# Altium project Flight Controller Base.PrjPcb (part 2 of 2)

## Sheet S6_Debug_Safety_Port.SchDoc
size 420 x 297 mm; SheetNumber: 6; SheetTotal: 8
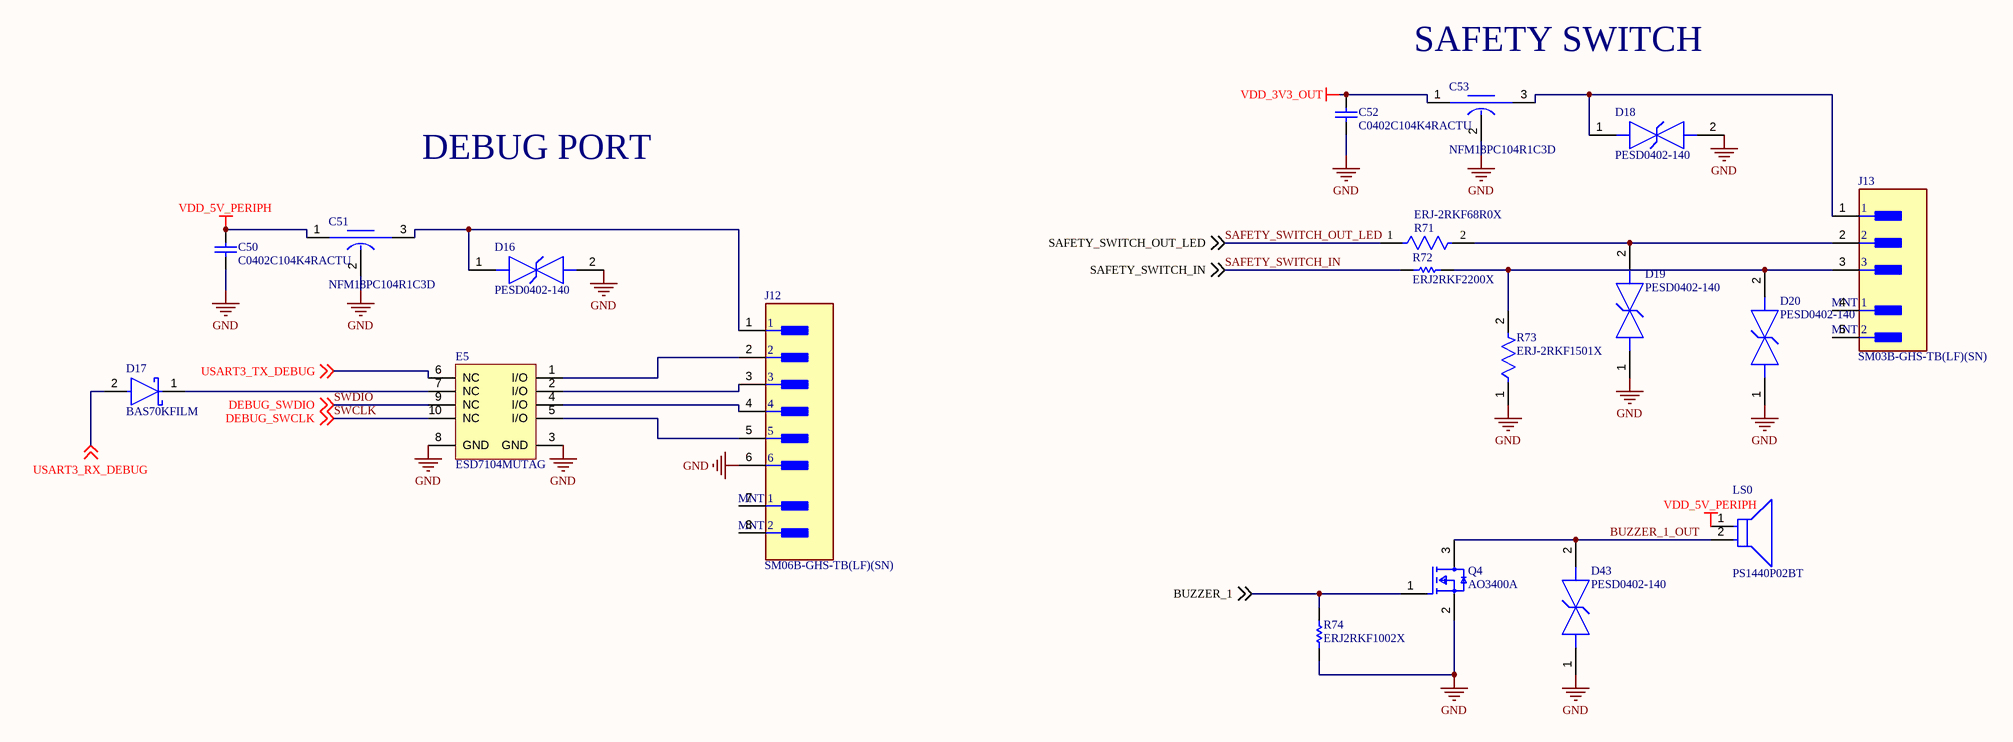
[diagram p5: S6_Debug_Safety_Port.SchDoc]

### Parts
C50  C0402C104K4RACTU  [CAPC1005X55X30LL05T10]
C51  NFM18PC104R1C3D  [FP-NFM18-0_1-e0_15_0_35-MFG]
C52  C0402C104K4RACTU  [CAPC1005X55X30LL05T10]
C53  NFM18PC104R1C3D  [FP-NFM18-0_1-e0_15_0_35-MFG]
D16  PESD0402-140  [FP-PESD0402-MFG]
D17  BAS70KFILM  [FP-SOD-523-IPC_B]
D18  PESD0402-140  [FP-PESD0402-MFG]
D19  PESD0402-140  [FP-PESD0402-MFG]
D20  PESD0402-140  [FP-PESD0402-MFG]
D43  PESD0402-140  [FP-PESD0402-MFG]
E5  ESD7104MUTAG  [ONSC-UDFN-10-517BB-01_V]
J12  SM06B-GHS-TB(LF)(SN)  [FP-SM06B-GHS-TB_LF_SN-MFG]
J13  SM03B-GHS-TB(LF)(SN)  [FP-SM03B-GHS-TB_LF_SN-MFG]
LS0  PS1440P02BT  [FP-PS1440P02BT-MFG]
Q4  AO3400A  [FP-SOT23-MFG]
R71  ERJ-2RKF68R0X  [FP-ERJ2RK-MFG]
R72  ERJ2RKF2200X  [RESC1005X40X25LL05T05]
R73  ERJ-2RKF1501X  [FP-ERJ2RK-IPC_A]
R74  ERJ2RKF1002X  [RESC1005X40X25LL05T05]

### Nets
GND: C50.1 C51.2(GND) C52.1 C53.2(GND) D16.2 D18.2 D19.1 D20.1 D43.1 E5.3(GND) E5.8(GND) J12.6 Q4.2(S) R73.1 R74.1
VDD_3V3_OUT: C52.2 C53.1(Input)
VDD_5V_PERIPH: C50.2 C51.1(Input) LS0.1
BUZZER_1: Q4.1(G) R74.2 ; off-sheet BUZZER_1
BUZZER_1_OUT: D43.2 LS0.2 Q4.3(D)
SAFETY_SWITCH_IN: R72.1 ; off-sheet SAFETY_SWITCH_IN
SAFETY_SWITCH_OUT_LED: R71.1 ; off-sheet SAFETY_SWITCH_OUT_LED
SWCLK: E5.10(NC) ; off-sheet DEBUG_SWCLK  [also labelled DEBUG_SWCLK]
SWDIO: E5.9(NC) ; off-sheet DEBUG_SWDIO  [also labelled DEBUG_SWDIO]
USART3_RX_DEBUG: D17.2(A) ; off-sheet USART3_RX_DEBUG
USART3_TX_DEBUG: E5.6(NC) ; off-sheet USART3_TX_DEBUG
NetC51_3: C51.3(Output) D16.1 J12.1
NetC53_3: C53.3(Output) D18.1 J13.1
NetD17_1: D17.1(C) E5.7(NC)
NetD19_2: D19.2 J13.2 R71.2
NetD20_2: D20.2 J13.3 R72.2 R73.2
NetE5_1: E5.1(I/O) J12.2
NetE5_2: E5.2(I/O) J12.3
NetE5_4: E5.4(I/O) J12.4
NetE5_5: E5.5(I/O) J12.5

Not connected (* = marked no-connect by the designer): J12 7(MNT_1) 8(MNT_2); J13 4(MNT_1) 5(MNT_2)

### Notes on the sheet
- (near C53) SAFETY SWITCH
- DEBUG PORT
- THIS DOCUMENT AND THE DATA DISCLOSED HEREIN OR
- HEREWITH IS THE PROPERTY OF ALTIUM LIMITED AND MAY
- DWG NO:
- REVISION
- REV:
- DESCRIPTION
- DATE
- APPROVED
- BE FREELY DISTRIBUTED IN WHOLE. NO RIGHTS ARE
- RESERVED OR EXPRESS OR IMPLIED WARANTEE GIVEN.
- ENG:
- APPROVALS
- PROJECT
- DSN:
- CHK:
- REFERENCE DOCUMENTS
- PROJECT REVISION:
- TITLE
- DOCUMENT REVISION:
- DESIGN ITEM:
- BOM:
- FAB DWG:
- PCB DWG:
- ASSY DWG:
- SCALE:
- A3
- SIZE
- CAGE CODE
- FILE NAME
- DWG NO.
- SHEET
- OF
- REV

### Library data of the parts
C50 C52 = CMP-0001-00074-2: Manufacturer: Kemet; Part Number: C0402C104K4RACTU
C51 C53 = CMP-06053-000054-1: Large Current 3 Terminals Low ESL Chip Multilayer Ceramic Capacitors for General Purpose, 0603, 0.10uF, 20%, 16V; Capacitance: 100nF; Insulation Resistance: 1GR; Current Rating: 2A; DC Resistance (DCR): 30mR; Case Code (Imperial): 0603; REACH SVHC: No SVHC; Width: 0.8mm; Case Code (Metric): 1608; Voltage Rating (DC): 16V; Case/Package: 0603; Packaging: Tape and Reel; Length: 1.6mm; Height: 0.6mm; Voltage: 16V; Depth: 0.8mm; Radiation Hardening: No; Max Operating Temperature: 125°C; Max Voltage Rating (DC): 16V; Voltage Rating: 16V; Max Current Rating: 2A; Tolerance: 20%; Min Operating Temperature: -55°C; Mount: PCB; Termination: Flat; Current: 2A; Package Quantity: 4000; Lead Free: Lead Free
D16 D18-D20 D43 = CMP-08607-000011-1: TVS DIODE 14V 40V 0402; Manufacturer: Littelfuse Inc.; Automotive Grade: Grade 1; Capacitance: 0.25pF; Value: 0.25pF; Direction: Bidirectional; Number Of Channels: 1; Temperature Range Low: -55°C; Lead Free: Yes; Temperature: -55°C to +125°C; Digikey Description: TVS DIODE 14V 40V 0402; Automotive: Yes; Device Class L2: TVS Diodes; Reverse Standoff Voltage: 14V; Device Class L1: Circuit Protection; Ipc Land Pattern Name: DIOC10050X33; Manufacturer Part Number: PESD0402-140; Breakdown Voltage: 14V; Height: 0.43mm; Clamping Voltage: 40V; RoHS: TRUE; Temperature Range High: +125°C; Device Class L3: unset; Octopart: https://octopart.com/pesd0402-140-littelfuse-74215061; Package: PESD0402; ComponentLink2URL: https://www.littelfuse.com/~/media/electronics/datasheets/polymer_esd_suppressors/littelfuse_polymer_esd_suppressor_pesd_catalog_datasheet.pdf.pdf; Category: Diode; ComponentLink2Description: Datasheet
D17 = CMP-12187-000033-1: DIODE SCHOTTKY 70V 70MA SOD523; Peak Non-Repetitive Surge Current: 1A; Forward Voltage: 1V; Element Configuration: Single; Polarity: Standard; Max Reverse Leakage Current: 10uA; Packaging: Tape and Reel; RoHS Compliant: Yes; Width: 0.9mm; Contact Plating: Tin; Series: -; Lead Free: Lead Free; REACH SVHC: No SVHC; Voltage Rating (DC): 70V; Current Rating: 70mA; Max Reverse Voltage (DC): 70V; Average Rectified Current: 70mA; Output Current: 70mA; Min Operating Temperature: -65°C; Length: 1.3mm; Max Operating Temperature: 150°C; Max Surge Current: 1A; Height: 0.7mm; Radiation Hardening: No; Mount: Surface Mount; Max Repetitive Reverse Voltage (Vrrm): 70V; Package Quantity: 1; Reverse Voltage (DC): 70V; Number of Pins: 2; Max Reverse Current: 10uA; Forward Current: 70mA
E5 = CMP-1063-00242-1: Transient Voltage Suppressor, Low Capacitance ESD Protection for High Speed Data, 10-Pin UDFN, Pb-Free, Tape and Reel; Manufacturer: On Semiconductor; IR Max (uA): 1; Number of Lines: 4; VRWM Max (V): 5; Direction: Bidirectional; V(BR) Min (V): 5.5; PackageDescription: 10-Pin Small Outline No-Lead, Body 2.5 x 1 mm, Pitch 0.5 mm; ComponentLink3URL: http://www.onsemi.com/pub_link/Collateral/517BB.PDF; PackageReference: UDFN-10-517BB-01; Mounting Technology: Surface Mount; PartNumber: ESD7104MUTAG; ComponentLink1URL: http://www.onsemi.com/; ComponentLink1Description: Manufacturer URL; DatasheetVersion: Rev. 2; ComponentLink2Description: Datasheet; ComponentLink2URL: http://www.onsemi.cn/pub_link/Collateral/ESD7104-D.PDF; PackageVersion: Rev. O, 11/2009; Packing: Tape and Reel; RoHS: Pb-Free; ComponentLink3Description: Package Specification
J12 = CMP-17439-000061-1: CONN HEADER SMD R/A 6POS 1.25MM; Number of Contacts: 6; Voltage Rating: 50V; Current Rating: 1A; Connector Type: Outer Shroud Contact; Contact Resistance: 50mR; Orientation: Right Angle; Max Operating Temperature: 85°C; Mount: Surface Mount; Packaging: Tape and Reel; Contact Plating: Tin; Depth: 4.05mm; Max Voltage Rating (AC): 50V; Lead Free: Lead Free; Pitch: 1.25mm; Number of Positions: 6; Max Current Rating: 1A; Termination: Solder; Min Operating Temperature: -25°C; Housing Color: Beige; Fastening Type: Ramp; Length: 10.75mm; Color: Natural; Contact Material: Bronze; Housing Material: Polyamide; Number of Rows: 1
J13 = CMP-17439-000068-1: CONN HEADER SMD R/A 3POS 1.25MM; Voltage Rating: 50V; Wire/Cable Gauge: 26AWG; Pitch: 0.049inch; Gender: Male; Number of Positions: 3; Current Rating: 1A; Orientation: Right Angle; REACH SVHC: No SVHC; Insulation Color: Natural; Housing Material: Nylon; Mount: Surface Mount; Flammability Rating: UL94 V-0; Color: Natural; Number of Rows: 1; Housing Color: Natural; Termination: Solder; Voltage Rating (AC): 50V; Max Operating Temperature: 85°C; Connector Type: Header; Series: GH; Packaging: Tape and Reel; Contact Finish - Mating: TIN; Lead Free: Lead Free; Fastening Type: Ramp; Contact Plating: Tin; Contact Material: Bronze; Insulation Material: Nylon; Contact Type: Outer Shroud Contact; Number of Contacts: 3; Min Operating Temperature: -25°C; Contact Shape: Rectangular
LS0 = CMP-08413-000003-1: AUDIO PIEZO TRANSDUCER 30V TH; Self Resonant Frequency: 4kHz; Washable: No; Voltage Rating (DC): 3V; Number of Terminals/Pins: 2; Packaging: Tape and Reel; Lead Free: Lead Free; Min Operating Temperature: -10°C; Package Quantity: 350; Termination: PC Pins; Mount: Through Hole; Max Operating Temperature: 70°C; Operating Supply Voltage: 3V; Diameter: 14mm; RoHS Compliant: Yes; Frequency: 4kHz; Height: 8mm
Q4 = CMP-83955-000006-1: MOSFET N-CH 30V 5.7A SOT23; Input Capacitance: 630pF; Number of Elements: 1; Rds On Max: 26.5mR; Max Power Dissipation: 1.4W; Gate to Source Voltage (Vgs): 12V; Min Operating Temperature: -55°C; Lead Free: Lead Free; Number of Pins: 3; Drain to Source Voltage (Vdss): 30V; Case/Package: SOT-23; Mount: Surface Mount; Continuous Drain Current (ID): 5.7A; Radiation Hardening: No; Packaging: Tape and Reel; Max Operating Temperature: 150°C; Power Dissipation: 1.4W
R71 = CMP-2002-01170-2: NexarPartId: 55529255; Voltage Rating: 50V; Temperature Coefficient: 100ppm/°C; Power Rating: 100mW; Resistance: 68Ω; Tolerance: 1%; Case Code (Imperial): 0402; Length: 1mm; REACH SVHC: No SVHC; Lead Free: Lead Free; Packaging: Cut Tape; RoHS: Compliant; Features: Automotive AEC-Q200; Voltage Rating (DC): 50V; Height: 350µm; Number of Pins: 2; Schedule B: 8533210045, 8533210045; Composition: Thick Film; Case/Package: 0402; Width: 508µm; Number of Terminations: 2; Min Operating Temperature: -55°C; Mount: Surface Mount; Depth: 500µm; Weight: 793.786648µg; Military Standard: Not; Termination: SMD/SMT; Max Power Dissipation: 100mW; Max Operating Temperature: 155°C; Lifecycle Status: Production; Contact Plating: Tin; Case Code (Metric): 1005
R72 = CMP-2002-01131-1: Manufacturer: Panasonic; Part Number: ERJ2RKF2200X
R73 = CMP-2002-00693-2: RES SMD 1.5K OHM 1% 1/10W 0402; Voltage Rating (DC): 50V; Temperature Coefficient: 100ppm/°C; Power Rating: 100mW; Resistance: 1.5kR; Features: Automotive AEC-Q200; Termination: SMD/SMT; Size Code: 0402; Mount: Surface Mount; Min Operating Temperature: -55°C; Construction: Rectangular; Case Code (Metric): 1005; Depth: 0.5mm; Max Operating Temperature: 155°C; RoHS Compliant: Yes; Packaging: Tape and Reel; Number of Pins: 2; Military Standard: Not; Package Quantity: 1; Height: 0.35mm; Resistor Type: Thick Film; Radiation Hardening: No; Length: 1mm; Case Code (Imperial): 0402; Tolerance: 1%; Voltage Rating: 50V; Resistance Tolerance: 1%; Contact Plating: Tin; Case/Package: 0402; REACH SVHC: No SVHC; Max Power Dissipation: 100mW; Series: ERJ; Technology: THICK FILM; Number of Terminations: 2; Width: 0.02inch; Lead Free: Lead Free
R74 = CMP-2000-07588-1: Chip Resistor, 10 KOhm, +/- 1%, 0.1 W, -55 to 155 degC, 0402 (1005 Metric), RoHS, Tape and Reel; Manufacturer: Panasonic; Power Rating: 100mW; Voltage Rating: 50V; Resistance: 10KOhm; Case\/Package: 0402; Temperature Coefficient: 100ppm\/degreesC; RoHSCompliant: True; Lead Free: LeadFree; Package Quantity: 1; Contact Plating: Tin; Length: 1mm; Radiation Hardening: No; REACH SVHC: NoSVHC; Max Operating Temperature: 155degC; Depth: 0.5mm; Case Code (Imperial): 0402; Military Standard: Not; Package Description: 2-Pin Surface Mount Device, Body 1 x 0.5 mm; Termination: SMD/SMT; Case Code (Metric): 1005; Height: 0.35mm; Packaging: TapeandReel; Voltage Rating (DC): 50V; Package Reference: 402; Number of Pins: 2; Tolerance: 1%; Mounting Technology: SurfaceMount; Width: 0.02inch; Mount: SurfaceMount; Datasheet URL: https://industrial.panasonic.com/cdbs/www-data/pdf/RDA0000/AOA0000C304.pdf; Composition: ThickFilm; Datasheet Version: 02/2017; Manufacturer URL: http://www.panasonic.com/; Max Power Dissipation: 100mW; Number of Terminations: 2; Min Operating Temperature: -55degC

## Sheet S7_Ethernet.SchDoc
size A3; SheetNumber: 4; SheetTotal: 7
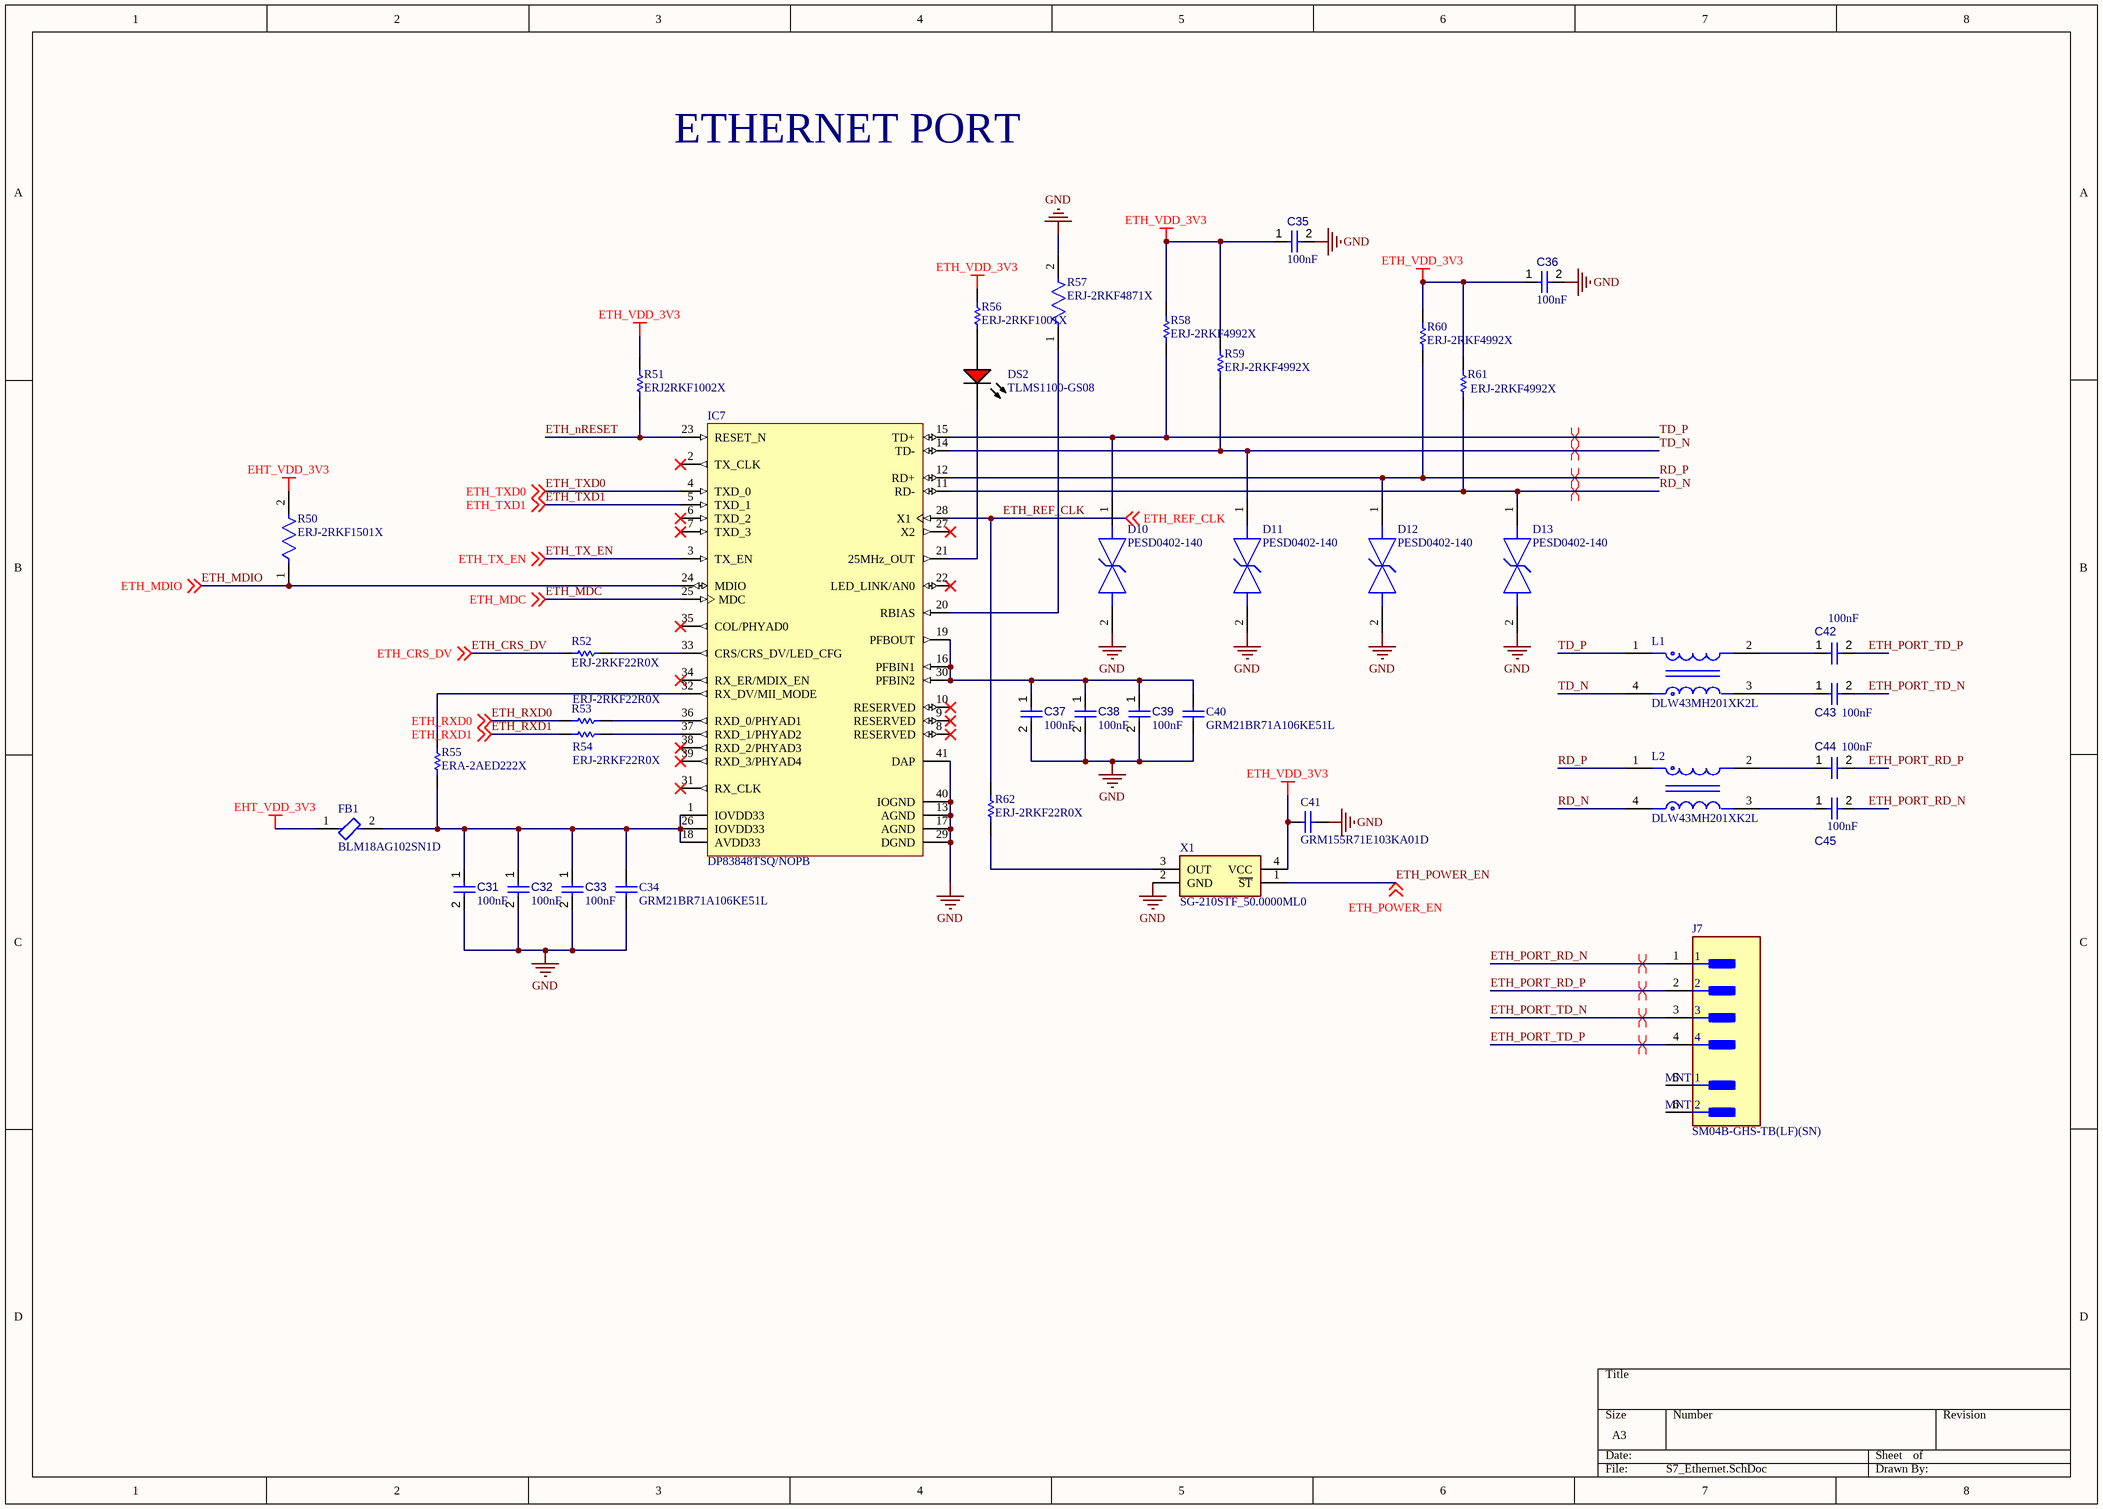
[diagram p6: S7_Ethernet.SchDoc]

### Parts
C31  value 100nF  [CAPC0402(1005)60_L]  (hidden comment: Capacitor 100nF +/-20% 25V 0402)
C32  value 100nF  [CAPC0402(1005)60_L]  (hidden comment: Capacitor 100nF +/-20% 25V 0402)
C33  value 100nF  [CAPC0402(1005)60_L]  (hidden comment: Capacitor 100nF +/-20% 25V 0402)
C34  GRM21BR71A106KE51L  [CAPC2013X140X45NL15T25]
C35  value 100nF  [CAPC0402(1005)60_L]  (hidden comment: Capacitor 100nF +/-20% 25V 0402)
C36  value 100nF  [CAPC0402(1005)60_L]  (hidden comment: Capacitor 100nF +/-20% 25V 0402)
C37  value 100nF  [CAPC0402(1005)60_L]  (hidden comment: Capacitor 100nF +/-20% 25V 0402)
C38  value 100nF  [CAPC0402(1005)60_L]  (hidden comment: Capacitor 100nF +/-20% 25V 0402)
C39  value 100nF  [CAPC0402(1005)60_L]  (hidden comment: Capacitor 100nF +/-20% 25V 0402)
C40  GRM21BR71A106KE51L  [CAPC2013X140X45NL15T25]
C41  GRM155R71E103KA01D  [CAPC1005X55X25LL05T10]
C42  value 100nF  [CAPC0402(1005)60_L]  (hidden comment: Capacitor 100nF +/-20% 25V 0402)
C43  value 100nF  [CAPC0402(1005)60_L]  (hidden comment: Capacitor 100nF +/-20% 25V 0402)
C44  value 100nF  [CAPC0402(1005)60_L]  (hidden comment: Capacitor 100nF +/-20% 25V 0402)
C45  value 100nF  [CAPC0402(1005)60_L]  (hidden comment: Capacitor 100nF +/-20% 25V 0402)
D10  PESD0402-140  [FP-PESD0402-MFG]
D11  PESD0402-140  [FP-PESD0402-MFG]
D12  PESD0402-140  [FP-PESD0402-MFG]
D13  PESD0402-140  [FP-PESD0402-MFG]
DS2  TLMS1100-GS08  [VISH-TLMX1100_V]
FB1  BLM18AG102SN1D  [FP-BLM18-0_15-t0_8-MFG]
IC7  DP83848TSQ/NOPB  [RTA0040A_V]
J7  SM04B-GHS-TB(LF)(SN)  [FP-SM04B-GHS-TB_LF_SN-MFG]
L1  DLW43MH201XK2L  [FP-DLW43-0_2-t2_7-MFG]
L2  DLW43MH201XK2L  [FP-DLW43-0_2-t2_7-MFG]
R50  ERJ-2RKF1501X  [FP-ERJ2RK-IPC_A]
R51  ERJ2RKF1002X  [RESC1005X40X25LL05T05]
R52  ERJ-2RKF22R0X  [RESC1005X40X25ML05T05]
R53  ERJ-2RKF22R0X  [RESC1005X40X25ML05T05]
R54  ERJ-2RKF22R0X  [RESC1005X40X25ML05T05]
R55  ERA-2AED222X  [RESC1005X40X25ML10T10]
R56  ERJ-2RKF1001X  [RESC1005X40X25NL05T05]
R57  ERJ-2RKF4871X  [FP-ERJ2RK-MFG]
R58  ERJ-2RKF4992X  [RESC1005X40X25LL05T05]
R59  ERJ-2RKF4992X  [RESC1005X40X25LL05T05]
R60  ERJ-2RKF4992X  [RESC1005X40X25LL05T05]
R61  ERJ-2RKF4992X  [RESC1005X40X25LL05T05]
R62  ERJ-2RKF22R0X  [RESC1005X40X25ML05T05]
X1  SG-210STF_50.0000ML0  [SG210STF500000ML0]

### Nets
EHT_VDD_3V3: FB1.1 R50.2
ETH_VDD_3V3: C35.1 C36.1 C41.1 R51.2 R56.2 R58.2 R59.2 R60.2 R61.2 X1.4(VCC)
GND: C31.2 C32.2 C33.2 C34.1 C35.2 C36.2 C37.2 C38.2 C39.2 C40.1 C41.2 D10.2 D11.2 D12.2 D13.2 IC7.13(AGND) IC7.17(AGND) IC7.29(DGND) IC7.40(IOGND) IC7.41(DAP) R57.2 X1.2(GND)
ETH_CRS_DV: R52.1 ; off-sheet ETH_CRS_DV
ETH_MDC: IC7.25(MDC) ; off-sheet ETH_MDC
ETH_MDIO: IC7.24(MDIO) R50.1 ; off-sheet ETH_MDIO
ETH_nRESET: IC7.23(RESET_N) R51.1
ETH_PORT_RD_N: C45.2 J7.1
ETH_PORT_RD_P: C44.2 J7.2
ETH_PORT_TD_N: C43.2 J7.3
ETH_PORT_TD_P: C42.2 J7.4
ETH_POWER_EN: X1.1(~{ST}) ; off-sheet ETH_POWER_EN
ETH_REF_CLK: IC7.28(X1) R62.2 ; off-sheet ETH_REF_CLK
ETH_RXD0: R53.1 ; off-sheet ETH_RXD0
ETH_RXD1: R54.1 ; off-sheet ETH_RXD1
ETH_TX_EN: IC7.3(TX_EN) ; off-sheet ETH_TX_EN
ETH_TXD0: IC7.4(TXD_0) ; off-sheet ETH_TXD0
ETH_TXD1: IC7.5(TXD_1) ; off-sheet ETH_TXD1
RD_N: D13.1 IC7.11(RD-) L2.4 R61.1
RD_P: D12.1 IC7.12(RD+) L2.1 R60.1
TD_N: D11.1 IC7.14(TD-) L1.4 R59.1
TD_P: D10.1 IC7.15(TD+) L1.1 R58.1
NetC31_1: C31.1 C32.1 C33.1 C34.2 FB1.2 IC7.1(IOVDD33) IC7.18(AVDD33) IC7.26(IOVDD33) R55.1
NetC37_1: C37.1 C38.1 C39.1 C40.2 IC7.16(PFBIN1) IC7.19(PFBOUT) IC7.30(PFBIN2)
NetC42_1: C42.1 L1.2
NetC43_1: C43.1 L1.3
NetC44_1: C44.1 L2.2
NetC45_1: C45.1 L2.3
NetDS2_1: DS2.1(A) R56.1
NetDS2_2: DS2.2(K) IC7.21(25MHz_OUT)
NetIC7_20: IC7.20(RBIAS) R57.1
NetIC7_32: IC7.32(RX_DV/MII_MODE) R55.2
NetIC7_33: IC7.33(CRS/CRS_DV/LED_CFG) R52.2
NetIC7_36: IC7.36(RXD_0/PHYAD1) R53.2
NetIC7_37: IC7.37(RXD_1/PHYAD2) R54.2
NetR62_1: R62.1 X1.3(OUT)

Not connected (* = marked no-connect by the designer): IC7 2(TX_CLK)* 6(TXD_2)* 7(TXD_3)* 8(RESERVED)* 9(RESERVED)* 10(RESERVED)* 22(LED_LINK/AN0)* 27(X2)* 31(RX_CLK)* 34(RX_ER/MDIX_EN)* 35(COL/PHYAD0)* 38(RXD_2/PHYAD3)* 39(RXD_3/PHYAD4)*; J7 5(MNT_1) 6(MNT_2)

### Layout directives
differential pair: ETH_PORT_RD_N, ETH_PORT_RD_P, ETH_PORT_TD_N, ETH_PORT_TD_P, RD_N, RD_P, TD_N, TD_P

### Notes on the sheet
- ETHERNET PORT

### Library data of the parts
C31-C33 C35-C39 C42-C45 = CMP-001-00065-4: Chip Capacitor, 100nF +/-20%, 25V, 0402, Thickness 0.6 mm; Tolerance: 10%; Max Operating Temperature: 85°C; Min Operating Temperature: -55°C; Pins: 2; Voltage Rating: 25V; Mounting Technology: SMT; Case/Package: 0402
C34 C40 = CMP-2007-03395-1: Manufacturer: Murata; Part Number: GRM21BR71A106KE51L
C41 = CMP-1034-01880-2: Manufacturer: Murata; Part Number: GRM155R71E103KA01D
D10-D13 = CMP-08607-000011-1: as D16 on sheet S6_Debug_Safety_Port; Temperature Range Low: -55°C; Lead Free: Yes; Temperature: -55°C to +125°C; Digikey Description: TVS DIODE 14V 40V 0402; Automotive: Yes; Device Class L2: TVS Diodes; Reverse Standoff Voltage: 14V; Device Class L1: Circuit Protection; Ipc Land Pattern Name: DIOC10050X33; Manufacturer Part Number: PESD0402-140; Breakdown Voltage: 14V; Height: 0.43mm; Clamping Voltage: 40V; RoHS: TRUE; Temperature Range High: +125°C; Device Class L3: unset; Octopart: https://octopart.com/pesd0402-140-littelfuse-74215061; Package: PESD0402; ComponentLink2URL: https://www.littelfuse.com/~/media/electronics/datasheets/polymer_esd_suppressors/littelfuse_polymer_esd_suppressor_pesd_catalog_datasheet.pdf.pdf; Category: Diode; ComponentLink2Description: Datasheet
DS2 = CMP-1666-00027-1: LED, RED, 2.1 V, -40 to 100 degC, 2-Pin SMD (0603), RoHS, Tape and Reel; Type (Capacitors): C0G; Resistance: 100000000000 Ohm; Capacitance: 12 pF; Voltage Rating: 50 V; Tolerance: 5%; Min Operating Temperature: -55degC; REACH SVHC: No SVHC; ComponentLink2Description: Datasheet; ComponentLink1URL: http://www.vishay.com/; Width: 0.8 mm; Package Quantity: 4000; PackageReference: TLMX1100; ComponentLink2URL: http://www.vishay.com/docs/83173/tlmb1100.pdf; Case/Package: 0603; Case Code (Metric): 1608; Packaging: Tape and Reel; Pins: 2; ComponentLink1Description: Manufacturer URL; Max Operating Temperature: 125degC; Height: 0.8 mm; Length: 1.6 mm; Mount: Surface Mount; PackageDescription: 2-Pin Surface Mount Device, Body 1.6 x 0.8 mm; DatasheetVersion: Rev. 2.7, 03/2016; Case Code (Imperial): 0603; Voltage Rating (DC): 50 V; RoHSCompliant: True; Radiation Hardening: No
FB1 = CMP-0686-00457-3: Chip Ferrite Bead, 0603, 1000Ω @ 100MHz, 0.5Ω, 25%, 450mA; Number of Circuits: 1; Max DC Current: 400mA; Shielding: Unshielded; DC Resistance (DCR): 500mR; Material: Steel; DC Resistance-Max: 700mR; Impedance: 1kR; Case Code (Imperial): 0603; Max Current Rating: 400mA; Frequency: 100MHz; Min Operating Temperature: -55°C; Case/Package: 0603; Depth: 0.8mm; Lead Free: Lead Free; Core Material: Ferrite; Current Rating: 400mA; Resistance: 500mR; Case Code (Metric): 1608; DC Current: 400mA; Package Quantity: 1; Packaging: Tape and Reel; Width: 0.8mm; Military Standard: Not; Height: 0.8mm; Series: BLM18A; Max Operating Temperature: 125°C; Tolerance: 25%; Termination: SMD/SMT; Test Frequency: 100MHz; Number of Lines: 1; Number of Pins: 2; REACH SVHC: No SVHC; Length: 1.6mm; Radiation Hardening: No
IC7 = CMP-0058-00190-4: PHYTER® Mini - Industrial Temperature Single 10/100 Ethernet Transceiver, 40-pin LLP, Pb-Free, 250 Reel; Manufacturer: Texas Instruments; PowerWise: N; PackageTopMarking: NS*UZXYTTE#*83848TSQ; CompType: Interface IC; High-Reliability: Y; PinCount: 40; RoHS: Y; PartNumber: DP83848TSQ/NOPB; ComponentLink1URL: http://www.ti.com/general/docs/lit/getliterature.tsp?genericPartNumber=DP83848T&fileType=pdf; PackageDescription: LLP, Quad, 6 x 6 x 0.8mm, 40 Lead, Small DAP, 0.5mm Pitch, No Pullback; ComponentLink1Description: Datasheet URL; PackageReference: RTA0040A
J7 = CMP-17439-000411-1: CONN HEADER SMD R/A 4POS 1.25MM; Voltage Rating: 50V; Number of Contacts: 4; Current Rating: 1A; Termination: Solder; Mount: Surface Mount; REACH SVHC: No SVHC; Packaging: Cut Tape; Contact Material: Bronze; Series: GH; Orientation: Right Angle; Lead Free: Lead Free; Housing Material: Nylon; Contact Plating: Tin; Housing Color: Natural; Number of Rows: 1; Pitch: 1.25mm; Number of Positions: 4
L1 L2 = CMP-06045-000406-1: CMC 200UH 110MA 2LN SMD AEC-Q200; Voltage Rating (DC): 20V; Number of Lines: 2; DC Resistance (DCR): 4.5R; Max Operating Temperature: 105°C; Packaging: Cut Tape; Mount: Surface Mount; Max Current Rating: 110mA; Ratings: AEC-Q200; Min Operating Temperature: -40°C
R50 = CMP-2002-00693-2: as R73 on sheet S6_Debug_Safety_Port; Features: Automotive AEC-Q200; Termination: SMD/SMT; Size Code: 0402; Mount: Surface Mount; Min Operating Temperature: -55°C; Construction: Rectangular; Case Code (Metric): 1005; Depth: 0.5mm; Max Operating Temperature: 155°C; RoHS Compliant: Yes; Packaging: Tape and Reel; Number of Pins: 2; Military Standard: Not; Package Quantity: 1; Height: 0.35mm; Resistor Type: Thick Film; Radiation Hardening: No; Length: 1mm; Case Code (Imperial): 0402; Tolerance: 1%; Voltage Rating: 50V; Resistance Tolerance: 1%; Contact Plating: Tin; Case/Package: 0402; REACH SVHC: No SVHC; Max Power Dissipation: 100mW; Series: ERJ; Technology: THICK FILM; Number of Terminations: 2; Width: 0.02inch; Lead Free: Lead Free
R51 = CMP-2000-07588-1: as R74 on sheet S6_Debug_Safety_Port; RoHSCompliant: True; Lead Free: LeadFree; Package Quantity: 1; Contact Plating: Tin; Length: 1mm; Radiation Hardening: No; REACH SVHC: NoSVHC; Max Operating Temperature: 155degC; Depth: 0.5mm; Case Code (Imperial): 0402; Military Standard: Not; Package Description: 2-Pin Surface Mount Device, Body 1 x 0.5 mm; Termination: SMD/SMT; Case Code (Metric): 1005; Height: 0.35mm; Packaging: TapeandReel; Voltage Rating (DC): 50V; Package Reference: 402; Number of Pins: 2; Tolerance: 1%; Mounting Technology: SurfaceMount; Width: 0.02inch; Mount: SurfaceMount; Datasheet URL: https://industrial.panasonic.com/cdbs/www-data/pdf/RDA0000/AOA0000C304.pdf; Composition: ThickFilm; Datasheet Version: 02/2017; Manufacturer URL: http://www.panasonic.com/; Max Power Dissipation: 100mW; Number of Terminations: 2; Min Operating Temperature: -55degC
R52-R54 R62 = CMP-2002-01135-4: Chip Resistor, 22 Ohm, +/- 1%, 0.1 W, -55 to 155 degC, 0402 (1005 Metric), RoHS, Tape and Reel; Case\/Package: 0402; Resistance: 22 Ohm; Power Rating: 100 mW; Voltage Rating: 50 V; ComponentLink2Description: Datasheet; PartNumber: ERJ-2RKF22R0X; Packaging: Tape and Reel; Weight: 2.8E-05oz; Pins: 2; Case Code (Imperial): 0402; Width: 0.5 mm; ComponentLink2URL: http://industrial.panasonic.com/cdbs/www-data/pdf/RDA0000/AOA0000C86.pdf; Height: 0.35 mm; PackageReference: 0402; REACH SVHC: Yes; Min Operating Temperature: -55 degC; Length: 1 mm; DatasheetVersion: 04/2015; RoHSCompliant: true; Package Quantity: 10000; Case Code (Metric): 1005; PackageDescription: 2-Pin Surface Mount Device, Body 1 x 0.5 mm; ComponentLink1URL: http://www.panasonic.com/; Mount: Surface Mount; Mounting Technology: Surface Mount; Tolerance: 1%; Max Operating Temperature: 155 degC; ComponentLink1Description: Manufacturer URL
R55 = CMP-2002-05848-1: Manufacturer: Panasonic; Part Number: ERA-2AED222X
R56 = CMP-1011-00510-4: Chip Resistor, 1 KOhm, +/- 1%, 100 mW, -55 to 155 degC, 0402 (1005 Metric), RoHS, Tape and Reel; Manufacturer: Basic Passives; Voltage Rating: 50 V; Case\/Package: 0402; Resistance: 1 KOhm; Power Rating: 100 mW; PartNumber: ERJ-2RKF1001X; DatasheetVersion: 04/2015; Radiation Hardening: No; Pins: 2; Height: 0.35 mm; RoHSCompliant: true; Case Code (Imperial): 0402; ComponentLink2Description: Datasheet; ComponentLink1Description: Manufacturer URL; PackageReference: 0402; Mount: Surface Mount; Package Quantity: 10000; Tolerance: 1%; ComponentLink1URL: http://www.panasonic.com/; PackageDescription: 2-Pin Surface Mount Device, Body 1 x 0.5 mm; Mounting Technology: Surface Mount; Case Code (Metric): 1005; ComponentLink2URL: http://industrial.panasonic.com/cdbs/www-data/pdf/RDA0000/AOA0000C86.pdf; REACH SVHC: Yes; Packaging: Tape and Reel; Max Operating Temperature: 155 degC; Min Operating Temperature: -55 degC; Width: 0.5 mm; Length: 1 mm
R57 = CMP-2002-00961-2: NexarPartId: 55560255; Voltage Rating (DC): 50V; Tolerance: 1%; Temperature Coefficient: 100ppm/°C; Power Rating: 100mW; Resistance: 4.87kΩ; Lead Free: Contains Lead; REACH SVHC: Yes; Number of Terminations: 2; Voltage Rating: 50V; Case Code (Imperial): 0402; Mount: Surface Mount; Features: Automotive AEC-Q200; Schedule B: 8533210045, 8533210045; Case/Package: 0402; Max Operating Temperature: 155°C; Contact Plating: Tin; Length: 1mm; Min Operating Temperature: -55°C; Termination: SMD/SMT; Packaging: Cut Tape (CT); Military Standard: Not; Composition: Thick Film; Height: 400µm; RoHS: Compliant; Lifecycle Status: Production; Width: 500µm; Case Code (Metric): 1005; Max Power Dissipation: 100mW; Depth: 500µm
R58-R61 = CMP-2002-00967-3: Chip Resistor, 49.9 KOhm, +/- 1%, 100 mW, -55 to 155 degC, 0402 (1005 Metric), RoHS, Tape and Reel; Manufacturer: Basic Passives; Case\/Package: 0402; Power Rating: 100 mW; Voltage Rating: 50 V; Pins: 2; Case Code (Imperial): 0402; Package Quantity: 10000; REACH SVHC: No SVHC; DatasheetVersion: 04/2015; Width: 0.5 mm; PartNumber: ERJ-2RKF4992X; Height: 0.35 mm; Case Code (Metric): 1005; ComponentLink2URL: http://industrial.panasonic.com/cdbs/www-data/pdf/RDA0000/AOA0000C86.pdf; Mounting Technology: Surface Mount; ComponentLink1Description: Manufacturer URL; Resistance: 49.9 KOhm; PackageDescription: 2-Pin Surface Mount Device, Body 1 x 0.5 mm; Radiation Hardening: No; RoHSCompliant: true; PackageReference: 0402; Max Operating Temperature: 155 degC; Packaging: Tape and Reel; Mount: Surface Mount; Tolerance: 1%; Min Operating Temperature: -55 degC; ComponentLink1URL: http://www.panasonic.com/; ComponentLink2Description: Datasheet; Length: 1 mm
X1 = SG-210STF_50.0000ML0: Crystal or Oscillator; Manufacturer_Name: Epson Timing; Manufacturer_Part_Number: SG-210STF 50.0000ML0; Datasheet Link: https://support.epson.biz/td/api/doc_check.php?dl=brief_SG-210STF_en.pdf; Height: 0.9mm; Mouser Part Number: 732-SG-210STF50ML0; Mouser Price/Stock: https://www.mouser.co.uk/ProductDetail/Epson-Timing/SG-210STF-50.0000ML0?qs=f9yNj16SXrJvigE28ot2ig%3D%3D; Arrow Part Number: SG-210STF 50.0000ML0; Arrow Price/Stock: https://www.arrow.com/en/products/sg-210stf50.0000ml0/epson-electronics-america?region=nac

## Sheet S6_Can_SPI_Uart_Ports.SchDoc
size 420 x 297 mm; SheetNumber: 6; SheetTotal: 7
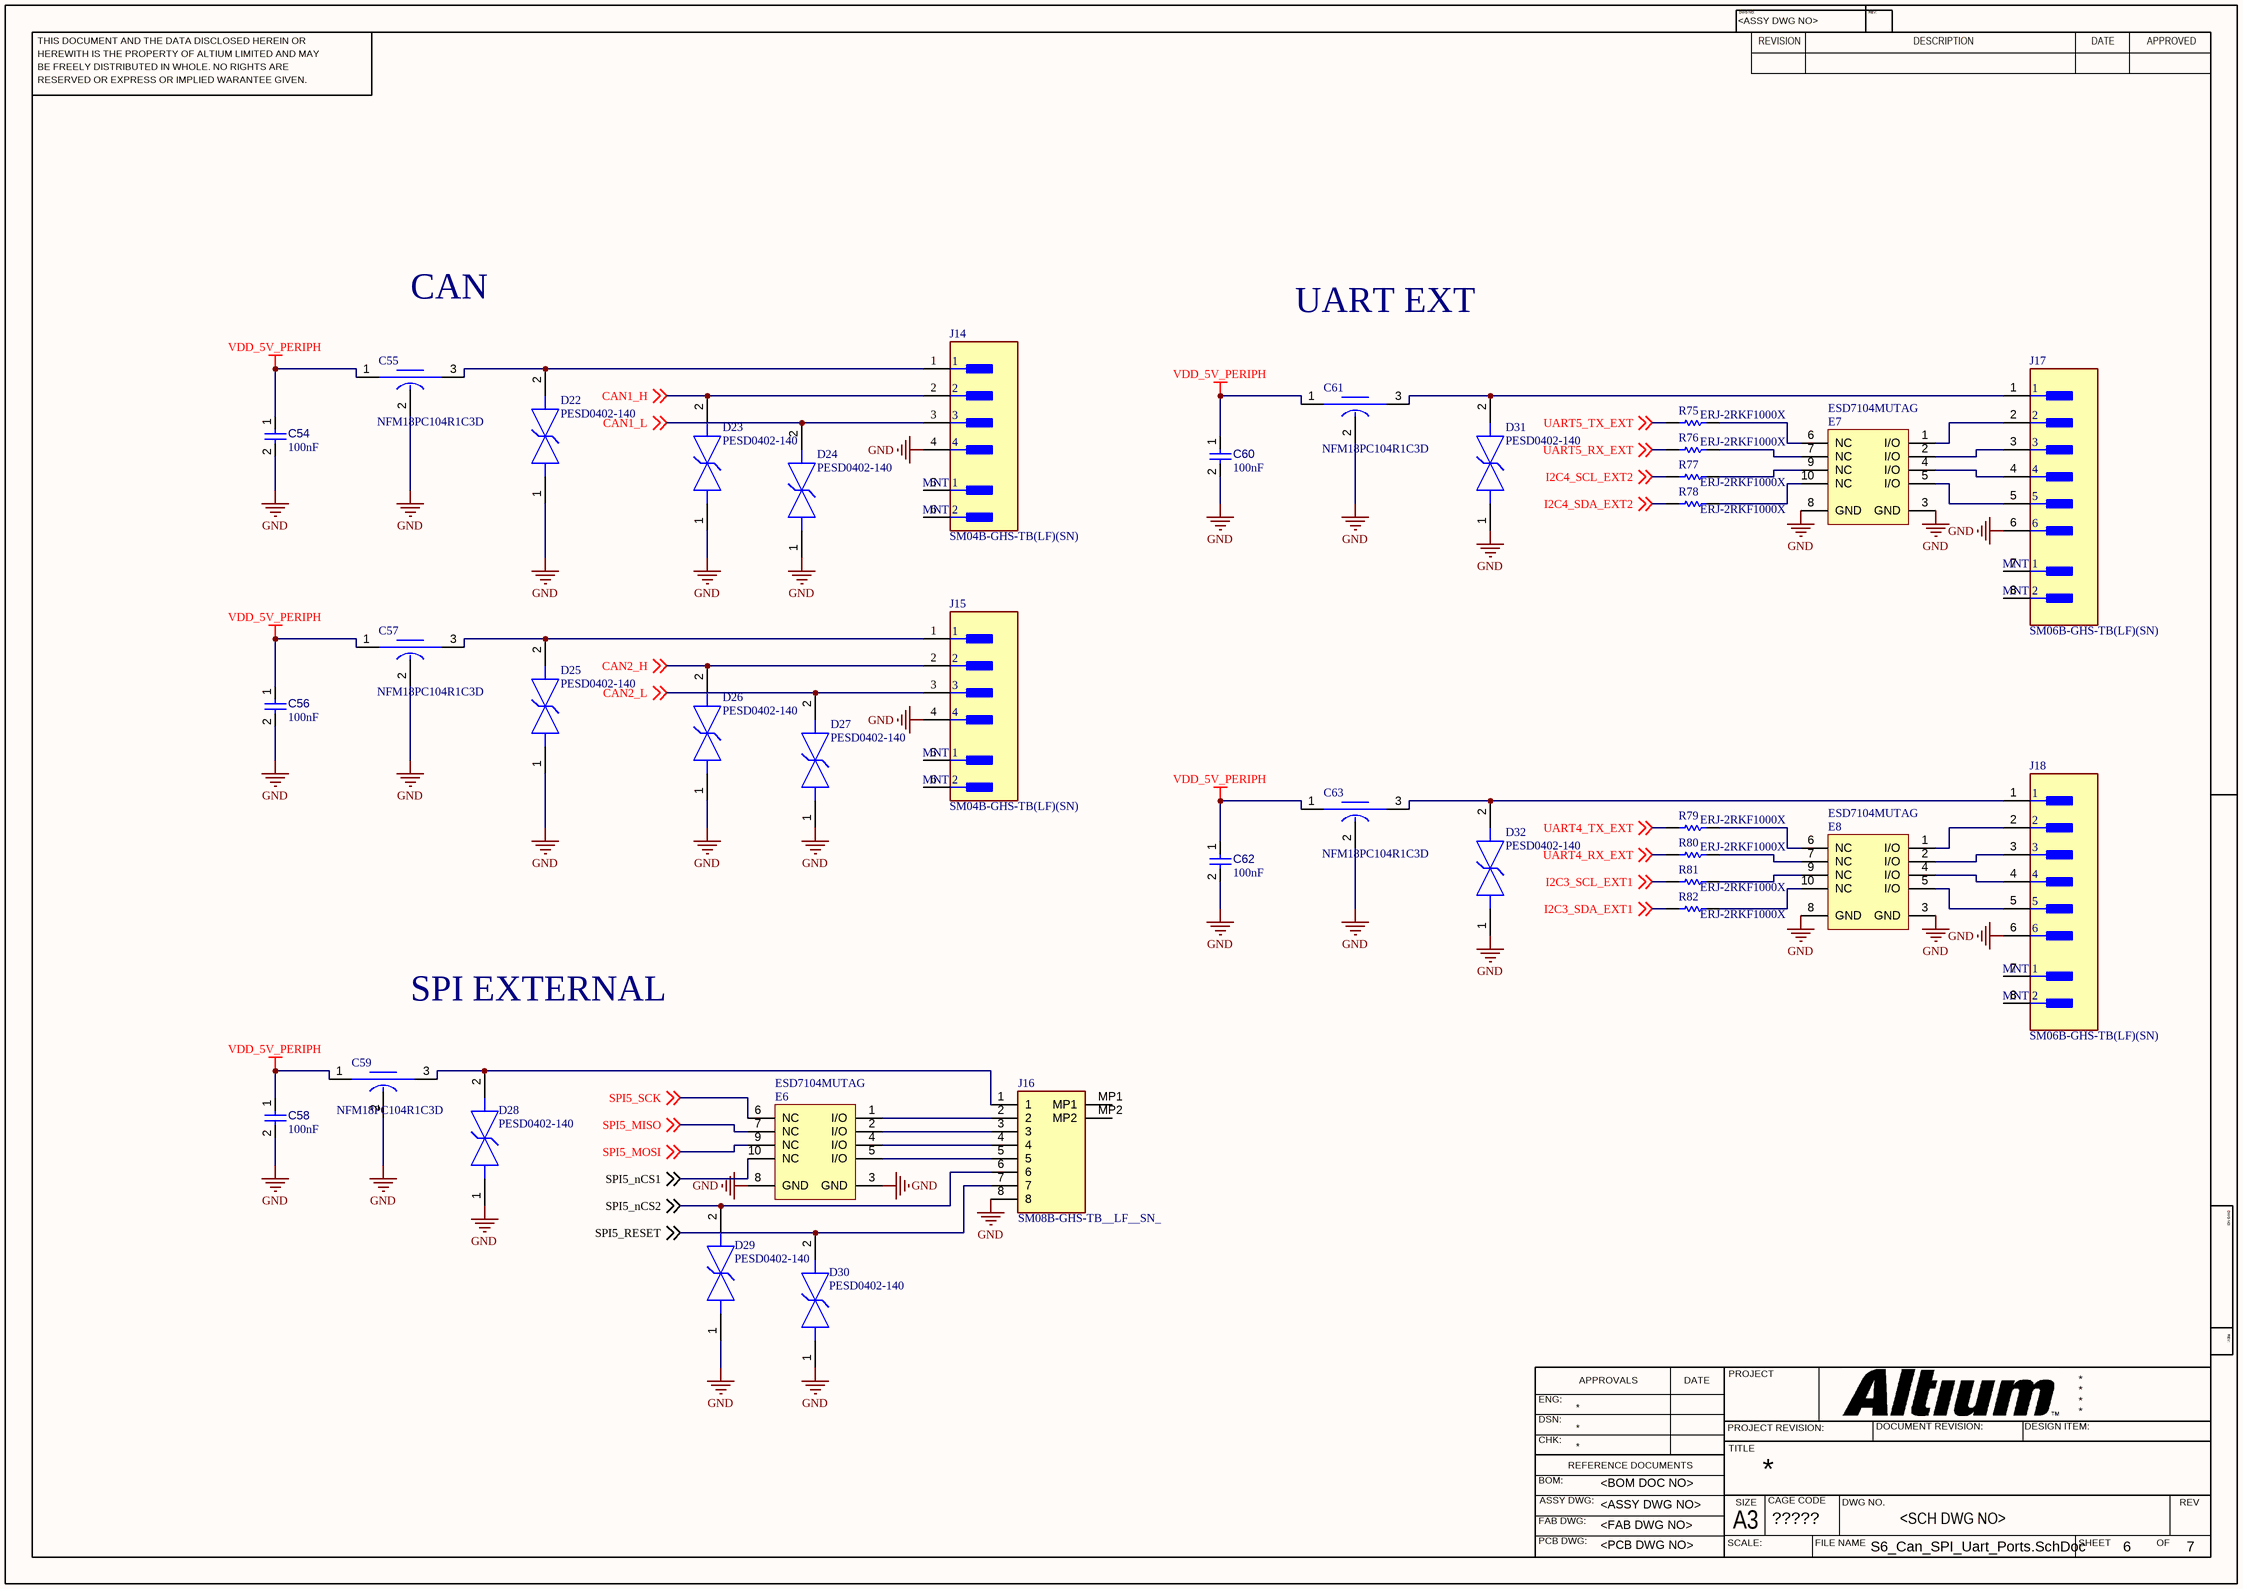
[diagram p7: S6_Can_SPI_Uart_Ports.SchDoc]

### Parts
C54  value 100nF  [CAPC0402(1005)60_L]  (hidden comment: Capacitor 100nF +/-20% 25V 0402)
C55  NFM18PC104R1C3D  [FP-NFM18-0_1-e0_15_0_35-MFG]
C56  value 100nF  [CAPC0402(1005)60_L]  (hidden comment: Capacitor 100nF +/-20% 25V 0402)
C57  NFM18PC104R1C3D  [FP-NFM18-0_1-e0_15_0_35-MFG]
C58  value 100nF  [CAPC0402(1005)60_L]  (hidden comment: Capacitor 100nF +/-20% 25V 0402)
C59  NFM18PC104R1C3D  [FP-NFM18-0_1-e0_15_0_35-MFG]
C60  value 100nF  [CAPC0402(1005)60_L]  (hidden comment: Capacitor 100nF +/-20% 25V 0402)
C61  NFM18PC104R1C3D  [FP-NFM18-0_1-e0_15_0_35-MFG]
C62  value 100nF  [CAPC0402(1005)60_L]  (hidden comment: Capacitor 100nF +/-20% 25V 0402)
C63  NFM18PC104R1C3D  [FP-NFM18-0_1-e0_15_0_35-MFG]
D22  PESD0402-140  [FP-PESD0402-MFG]
D23  PESD0402-140  [FP-PESD0402-MFG]
D24  PESD0402-140  [FP-PESD0402-MFG]
D25  PESD0402-140  [FP-PESD0402-MFG]
D26  PESD0402-140  [FP-PESD0402-MFG]
D27  PESD0402-140  [FP-PESD0402-MFG]
D28  PESD0402-140  [FP-PESD0402-MFG]
D29  PESD0402-140  [FP-PESD0402-MFG]
D30  PESD0402-140  [FP-PESD0402-MFG]
D31  PESD0402-140  [FP-PESD0402-MFG]
D32  PESD0402-140  [FP-PESD0402-MFG]
E6  ESD7104MUTAG  [ONSC-UDFN-10-517BB-01_V]
E7  ESD7104MUTAG  [ONSC-UDFN-10-517BB-01_V]
E8  ESD7104MUTAG  [ONSC-UDFN-10-517BB-01_V]
J14  SM04B-GHS-TB(LF)(SN)  [FP-SM04B-GHS-TB_LF_SN-MFG]
J15  SM04B-GHS-TB(LF)(SN)  [FP-SM04B-GHS-TB_LF_SN-MFG]
J16  SM08B-GHS-TB__LF__SN_  [SM08BGHSTBLFSN]
J17  SM06B-GHS-TB(LF)(SN)  [FP-SM06B-GHS-TB_LF_SN-MFG]
J18  SM06B-GHS-TB(LF)(SN)  [FP-SM06B-GHS-TB_LF_SN-MFG]
R75  ERJ-2RKF1000X  [RESC1005X40X25LL05T05]
R76  ERJ-2RKF1000X  [RESC1005X40X25LL05T05]
R77  ERJ-2RKF1000X  [RESC1005X40X25LL05T05]
R78  ERJ-2RKF1000X  [RESC1005X40X25LL05T05]
R79  ERJ-2RKF1000X  [RESC1005X40X25LL05T05]
R80  ERJ-2RKF1000X  [RESC1005X40X25LL05T05]
R81  ERJ-2RKF1000X  [RESC1005X40X25LL05T05]
R82  ERJ-2RKF1000X  [RESC1005X40X25LL05T05]

### Nets
GND: C54.2 C55.2(GND) C56.2 C57.2(GND) C58.2 C59.2(GND) C60.2 C61.2(GND) C62.2 C63.2(GND) D22.1 D23.1 D24.1 D25.1 D26.1 D27.1 D28.1 D29.1 D30.1 D31.1 D32.1 E6.3(GND) E6.8(GND) E7.3(GND) E7.8(GND) E8.3(GND) E8.8(GND) J14.4 J15.4 J16.8 J17.6 J18.6
VDD_5V_PERIPH: C54.1 C55.1(Input) C56.1 C57.1(Input) C58.1 C59.1(Input) C60.1 C61.1(Input) C62.1 C63.1(Input)
CAN1_H: D23.2 J14.2 ; off-sheet CAN1_H
CAN1_L: D24.2 J14.3 ; off-sheet CAN1_L
CAN2_H: D26.2 J15.2 ; off-sheet CAN2_H
CAN2_L: D27.2 J15.3 ; off-sheet CAN2_L
I2C3_SCL_EXT1: R81.1 ; off-sheet I2C3_SCL_EXT1
I2C3_SDA_EXT1: R82.1 ; off-sheet I2C3_SDA_EXT1
I2C4_SCL_EXT2: R77.1 ; off-sheet I2C4_SCL_EXT2
I2C4_SDA_EXT2: R78.1 ; off-sheet I2C4_SDA_EXT2
SPI5_MISO: E6.7(NC) ; off-sheet SPI5_MISO
SPI5_MOSI: E6.9(NC) ; off-sheet SPI5_MOSI
SPI5_nCS1: E6.10(NC) ; off-sheet SPI5_nCS1
SPI5_nCS2: D29.2 J16.6 ; off-sheet SPI5_nCS2
SPI5_RESET: D30.2 J16.7 ; off-sheet SPI5_RESET
SPI5_SCK: E6.6(NC) ; off-sheet SPI5_SCK
UART4_RX_EXT: R80.1 ; off-sheet UART4_RX_EXT
UART4_TX_EXT: R79.1 ; off-sheet UART4_TX_EXT
UART5_RX_EXT: R76.1 ; off-sheet UART5_RX_EXT
UART5_TX_EXT: R75.1 ; off-sheet UART5_TX_EXT
NetC55_3: C55.3(Output) D22.2 J14.1
NetC57_3: C57.3(Output) D25.2 J15.1
NetC59_3: C59.3(Output) D28.2 J16.1
NetC61_3: C61.3(Output) D31.2 J17.1
NetC63_3: C63.3(Output) D32.2 J18.1
NetE6_1: E6.1(I/O) J16.2
NetE6_2: E6.2(I/O) J16.3
NetE6_4: E6.4(I/O) J16.4
NetE6_5: E6.5(I/O) J16.5
NetE7_1: E7.1(I/O) J17.2
NetE7_2: E7.2(I/O) J17.3
NetE7_4: E7.4(I/O) J17.4
NetE7_5: E7.5(I/O) J17.5
NetE7_6: E7.6(NC) R75.2
NetE7_7: E7.7(NC) R76.2
NetE7_9: E7.9(NC) R77.2
NetE7_10: E7.10(NC) R78.2
NetE8_1: E8.1(I/O) J18.2
NetE8_2: E8.2(I/O) J18.3
NetE8_4: E8.4(I/O) J18.4
NetE8_5: E8.5(I/O) J18.5
NetE8_6: E8.6(NC) R79.2
NetE8_7: E8.7(NC) R80.2
NetE8_9: E8.9(NC) R81.2
NetE8_10: E8.10(NC) R82.2

Not connected (* = marked no-connect by the designer): J14 5(MNT_1) 6(MNT_2); J15 5(MNT_1) 6(MNT_2); J16 MP1 MP2; J17 7(MNT_1) 8(MNT_2); J18 7(MNT_1) 8(MNT_2)

### Notes on the sheet
- CAN
- UART EXT
- SPI EXTERNAL
- THIS DOCUMENT AND THE DATA DISCLOSED HEREIN OR
- HEREWITH IS THE PROPERTY OF ALTIUM LIMITED AND MAY
- DWG NO:
- REVISION
- REV:
- DESCRIPTION
- DATE
- APPROVED
- BE FREELY DISTRIBUTED IN WHOLE. NO RIGHTS ARE
- RESERVED OR EXPRESS OR IMPLIED WARANTEE GIVEN.
- ENG:
- APPROVALS
- PROJECT
- DSN:
- CHK:
- REFERENCE DOCUMENTS
- PROJECT REVISION:
- TITLE
- DOCUMENT REVISION:
- DESIGN ITEM:
- BOM:
- FAB DWG:
- PCB DWG:
- ASSY DWG:
- SCALE:
- A3
- SIZE
- CAGE CODE
- FILE NAME
- DWG NO.
- SHEET
- OF
- REV

### Library data of the parts
C54 C56 C58 C60 C62 = CMP-001-00065-4: as C31 on sheet S7_Ethernet; Max Operating Temperature: 85°C; Min Operating Temperature: -55°C; Pins: 2; Voltage Rating: 25V; Mounting Technology: SMT; Case/Package: 0402
C55 C57 C59 C61 C63 = CMP-06053-000054-1: as C51 on sheet S6_Debug_Safety_Port; Case Code (Imperial): 0603; REACH SVHC: No SVHC; Width: 0.8mm; Case Code (Metric): 1608; Voltage Rating (DC): 16V; Case/Package: 0603; Packaging: Tape and Reel; Length: 1.6mm; Height: 0.6mm; Voltage: 16V; Depth: 0.8mm; Radiation Hardening: No; Max Operating Temperature: 125°C; Max Voltage Rating (DC): 16V; Voltage Rating: 16V; Max Current Rating: 2A; Tolerance: 20%; Min Operating Temperature: -55°C; Mount: PCB; Termination: Flat; Current: 2A; Package Quantity: 4000; Lead Free: Lead Free
D22-D32 = CMP-08607-000011-1: as D16 on sheet S6_Debug_Safety_Port; Temperature Range Low: -55°C; Lead Free: Yes; Temperature: -55°C to +125°C; Digikey Description: TVS DIODE 14V 40V 0402; Automotive: Yes; Device Class L2: TVS Diodes; Reverse Standoff Voltage: 14V; Device Class L1: Circuit Protection; Ipc Land Pattern Name: DIOC10050X33; Manufacturer Part Number: PESD0402-140; Breakdown Voltage: 14V; Height: 0.43mm; Clamping Voltage: 40V; RoHS: TRUE; Temperature Range High: +125°C; Device Class L3: unset; Octopart: https://octopart.com/pesd0402-140-littelfuse-74215061; Package: PESD0402; ComponentLink2URL: https://www.littelfuse.com/~/media/electronics/datasheets/polymer_esd_suppressors/littelfuse_polymer_esd_suppressor_pesd_catalog_datasheet.pdf.pdf; Category: Diode; ComponentLink2Description: Datasheet
E6-E8 = CMP-1063-00242-1: as E5 on sheet S6_Debug_Safety_Port; PackageDescription: 10-Pin Small Outline No-Lead, Body 2.5 x 1 mm, Pitch 0.5 mm; ComponentLink3URL: http://www.onsemi.com/pub_link/Collateral/517BB.PDF; PackageReference: UDFN-10-517BB-01; Mounting Technology: Surface Mount; PartNumber: ESD7104MUTAG; ComponentLink1URL: http://www.onsemi.com/; ComponentLink1Description: Manufacturer URL; DatasheetVersion: Rev. 2; ComponentLink2Description: Datasheet; ComponentLink2URL: http://www.onsemi.cn/pub_link/Collateral/ESD7104-D.PDF; PackageVersion: Rev. O, 11/2009; Packing: Tape and Reel; RoHS: Pb-Free; ComponentLink3Description: Package Specification
J14 J15 = CMP-17439-000411-1: as J7 on sheet S7_Ethernet; Termination: Solder; Mount: Surface Mount; REACH SVHC: No SVHC; Packaging: Cut Tape; Contact Material: Bronze; Series: GH; Orientation: Right Angle; Lead Free: Lead Free; Housing Material: Nylon; Contact Plating: Tin; Housing Color: Natural; Number of Rows: 1; Pitch: 1.25mm; Number of Positions: 4
J16 = SM08B-GHS-TB__LF__SN_: Connector; Manufacturer_Name: JST (JAPAN SOLDERLESS TERMINALS); Manufacturer_Part_Number: SM08B-GHS-TB (LF)(SN); Datasheet Link: https://www.arrow.com/en/products/sm08b-ghs-tb-lf-sn/jst-manufacturing; Height: 4.25mm; Arrow Part Number: SM08B-GHS-TB (LF)(SN); Arrow Price/Stock: https://www.arrow.com/en/products/sm08b-ghs-tb-lf-sn/jst-manufacturing
J17 J18 = CMP-17439-000061-1: as J12 on sheet S6_Debug_Safety_Port; Orientation: Right Angle; Max Operating Temperature: 85°C; Mount: Surface Mount; Packaging: Tape and Reel; Contact Plating: Tin; Depth: 4.05mm; Max Voltage Rating (AC): 50V; Lead Free: Lead Free; Pitch: 1.25mm; Number of Positions: 6; Max Current Rating: 1A; Termination: Solder; Min Operating Temperature: -25°C; Housing Color: Beige; Fastening Type: Ramp; Length: 10.75mm; Color: Natural; Contact Material: Bronze; Housing Material: Polyamide; Number of Rows: 1
R75-R82 = CMP-2002-00605-3: Chip Resistor, 100 Ohm, +/- 1%, 100 mW, -55 to 155 degC, 0402 (1005 Metric), RoHS, Tape and Reel; Manufacturer: Basic Passives; Power Rating: 100 mW; Resistance: 100 Ohm; Voltage Rating: 50 V; Case\/Package: 0402; Width: 0.5 mm; Pins: 2; ComponentLink2Description: Datasheet; PackageReference: 0402; Height: 0.35 mm; Tolerance: 1%; DatasheetVersion: 04/2015; Case Code (Imperial): 0402; Min Operating Temperature: -55 degC; Radiation Hardening: No; Length: 1 mm; Package Quantity: 10000; PackageDescription: 2-Pin Surface Mount Device, Body 1 x 0.5 mm; Mounting Technology: Surface Mount; Case Code (Metric): 1005; Packaging: Tape and Reel; ComponentLink1URL: http://www.panasonic.com/; RoHSCompliant: true; Max Operating Temperature: 155 degC; REACH SVHC: Yes; PartNumber: ERJ-2RKF1000X; ComponentLink1Description: Manufacturer URL; ComponentLink2URL: http://industrial.panasonic.com/cdbs/www-data/pdf/RDA0000/AOA0000C86.pdf; Mount: Surface Mount

## Sheet S7_CRSF_IBUS_SBUS_DSM_Ports.SchDoc
size 420 x 297 mm; SheetNumber: 9; SheetTotal: 9
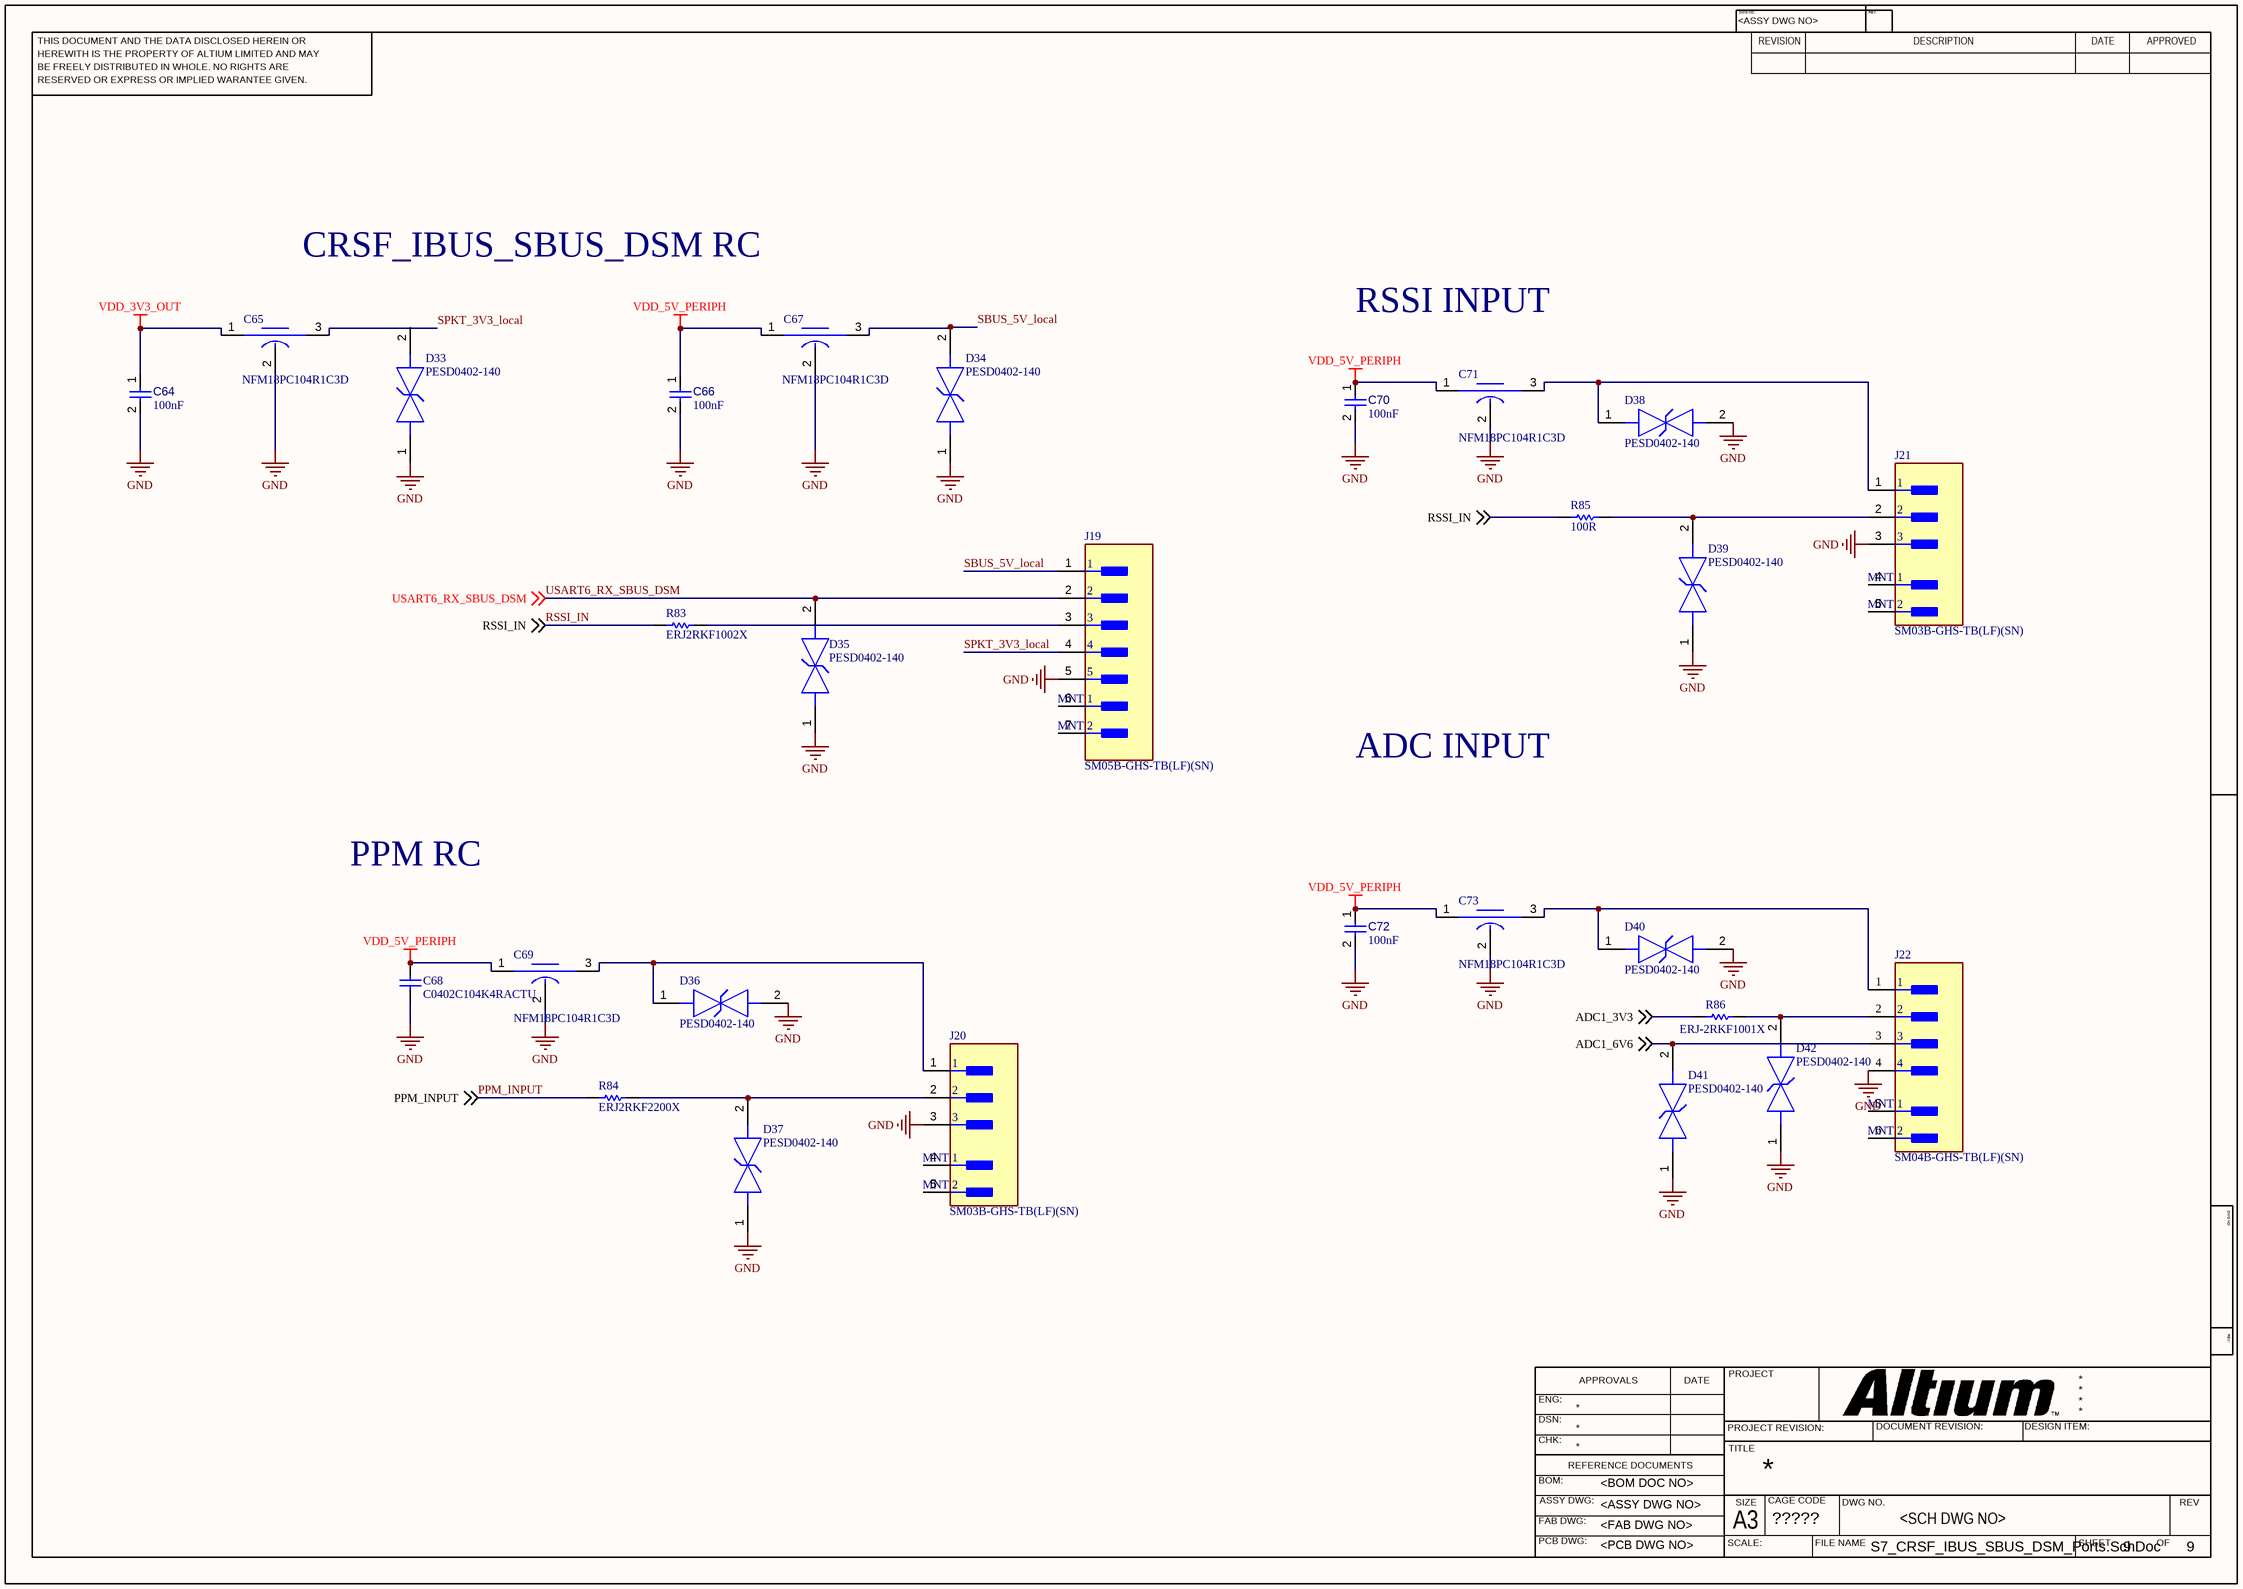
[diagram p8: S7_CRSF_IBUS_SBUS_DSM_Ports.SchDoc]

### Parts
C64  value 100nF  [CAPC0402(1005)60_L]  (hidden comment: Capacitor 100nF +/-20% 25V 0402)
C65  NFM18PC104R1C3D  [FP-NFM18-0_1-e0_15_0_35-MFG]
C66  value 100nF  [CAPC0402(1005)60_L]  (hidden comment: Capacitor 100nF +/-20% 25V 0402)
C67  NFM18PC104R1C3D  [FP-NFM18-0_1-e0_15_0_35-MFG]
C68  C0402C104K4RACTU  [CAPC1005X55X30LL05T10]
C69  NFM18PC104R1C3D  [FP-NFM18-0_1-e0_15_0_35-MFG]
C70  value 100nF  [CAPC0402(1005)60_L]  (hidden comment: Capacitor 100nF +/-20% 25V 0402)
C71  NFM18PC104R1C3D  [FP-NFM18-0_1-e0_15_0_35-MFG]
C72  value 100nF  [CAPC0402(1005)60_L]  (hidden comment: Capacitor 100nF +/-20% 25V 0402)
C73  NFM18PC104R1C3D  [FP-NFM18-0_1-e0_15_0_35-MFG]
D33  PESD0402-140  [FP-PESD0402-MFG]
D34  PESD0402-140  [FP-PESD0402-MFG]
D35  PESD0402-140  [FP-PESD0402-MFG]
D36  PESD0402-140  [FP-PESD0402-MFG]
D37  PESD0402-140  [FP-PESD0402-MFG]
D38  PESD0402-140  [FP-PESD0402-MFG]
D39  PESD0402-140  [FP-PESD0402-MFG]
D40  PESD0402-140  [FP-PESD0402-MFG]
D41  PESD0402-140  [FP-PESD0402-MFG]
D42  PESD0402-140  [FP-PESD0402-MFG]
J19  SM05B-GHS-TB(LF)(SN)  [FP-SM05B-GHS-TB_LF_SN-MFG]
J20  SM03B-GHS-TB(LF)(SN)  [FP-SM03B-GHS-TB_LF_SN-MFG]
J21  SM03B-GHS-TB(LF)(SN)  [FP-SM03B-GHS-TB_LF_SN-MFG]
J22  SM04B-GHS-TB(LF)(SN)  [FP-SM04B-GHS-TB_LF_SN-MFG]
R83  ERJ2RKF1002X  [RESC1005X40X25LL05T05]
R84  ERJ2RKF2200X  [RESC1005X40X25LL05T05]
R85  100R  [RESC1005X40X25LL05T10]
R86  ERJ-2RKF1001X  [RESC1005X40X25NL05T05]

### Nets
GND: C64.2 C65.2(GND) C66.2 C67.2(GND) C68.1 C69.2(GND) C70.2 C71.2(GND) C72.2 C73.2(GND) D33.1 D34.1 D35.1 D36.2 D37.1 D38.2 D39.1 D40.2 D41.1 D42.1 J19.5 J20.3 J21.3 J22.4
VDD_3V3_OUT: C64.1 C65.1(Input)
VDD_5V_PERIPH: C66.1 C67.1(Input) C68.2 C69.1(Input) C70.1 C71.1(Input) C72.1 C73.1(Input)
ADC1_3V3: R86.2 ; off-sheet ADC1_3V3
ADC1_6V6: D41.2 J22.3 ; off-sheet ADC1_6V6
PPM_INPUT: R84.1 ; off-sheet PPM_INPUT
RSSI_IN: R83.1 R85.1 ; off-sheet RSSI_IN
SBUS_5V_local: C67.3(Output) D34.2 J19.1
SPKT_3V3_local: C65.3(Output) J19.4
USART6_RX_SBUS_DSM: D35.2 J19.2 ; off-sheet USART6_RX_SBUS_DSM
NetC69_3: C69.3(Output) D36.1 J20.1
NetC71_3: C71.3(Output) D38.1 J21.1
NetC73_3: C73.3(Output) D40.1 J22.1
NetD37_2: D37.2 J20.2 R84.2
NetD39_2: D39.2 J21.2 R85.2
NetD42_2: D42.2 J22.2 R86.1
NetJ19_3: J19.3 R83.2

Not connected (* = marked no-connect by the designer): D33 2; J19 6(MNT_1) 7(MNT_2); J20 4(MNT_1) 5(MNT_2); J21 4(MNT_1) 5(MNT_2); J22 5(MNT_1) 6(MNT_2)

### Notes on the sheet
- CRSF_IBUS_SBUS_DSM RC
- RSSI INPUT
- ADC INPUT
- PPM RC
- THIS DOCUMENT AND THE DATA DISCLOSED HEREIN OR
- HEREWITH IS THE PROPERTY OF ALTIUM LIMITED AND MAY
- DWG NO:
- REVISION
- REV:
- DESCRIPTION
- DATE
- APPROVED
- BE FREELY DISTRIBUTED IN WHOLE. NO RIGHTS ARE
- RESERVED OR EXPRESS OR IMPLIED WARANTEE GIVEN.
- ENG:
- APPROVALS
- PROJECT
- DSN:
- CHK:
- REFERENCE DOCUMENTS
- PROJECT REVISION:
- TITLE
- DOCUMENT REVISION:
- DESIGN ITEM:
- BOM:
- FAB DWG:
- PCB DWG:
- ASSY DWG:
- SCALE:
- A3
- SIZE
- CAGE CODE
- FILE NAME
- DWG NO.
- SHEET
- OF
- REV

### Library data of the parts
C64 C66 C70 C72 = CMP-001-00065-4: as C31 on sheet S7_Ethernet; Max Operating Temperature: 85°C; Min Operating Temperature: -55°C; Pins: 2; Voltage Rating: 25V; Mounting Technology: SMT; Case/Package: 0402
C65 C67 C69 C71 C73 = CMP-06053-000054-1: as C51 on sheet S6_Debug_Safety_Port; Case Code (Imperial): 0603; REACH SVHC: No SVHC; Width: 0.8mm; Case Code (Metric): 1608; Voltage Rating (DC): 16V; Case/Package: 0603; Packaging: Tape and Reel; Length: 1.6mm; Height: 0.6mm; Voltage: 16V; Depth: 0.8mm; Radiation Hardening: No; Max Operating Temperature: 125°C; Max Voltage Rating (DC): 16V; Voltage Rating: 16V; Max Current Rating: 2A; Tolerance: 20%; Min Operating Temperature: -55°C; Mount: PCB; Termination: Flat; Current: 2A; Package Quantity: 4000; Lead Free: Lead Free
C68 = CMP-0001-00074-2: Manufacturer: Kemet; Part Number: C0402C104K4RACTU
D33-D42 = CMP-08607-000011-1: as D16 on sheet S6_Debug_Safety_Port; Temperature Range Low: -55°C; Lead Free: Yes; Temperature: -55°C to +125°C; Digikey Description: TVS DIODE 14V 40V 0402; Automotive: Yes; Device Class L2: TVS Diodes; Reverse Standoff Voltage: 14V; Device Class L1: Circuit Protection; Ipc Land Pattern Name: DIOC10050X33; Manufacturer Part Number: PESD0402-140; Breakdown Voltage: 14V; Height: 0.43mm; Clamping Voltage: 40V; RoHS: TRUE; Temperature Range High: +125°C; Device Class L3: unset; Octopart: https://octopart.com/pesd0402-140-littelfuse-74215061; Package: PESD0402; ComponentLink2URL: https://www.littelfuse.com/~/media/electronics/datasheets/polymer_esd_suppressors/littelfuse_polymer_esd_suppressor_pesd_catalog_datasheet.pdf.pdf; Category: Diode; ComponentLink2Description: Datasheet
J19 = CMP-17439-000048-1: CONN HEADER SMD R/A 5POS 1.25MM; Current Rating: 1A; Pitch: 0.049inch; Connector Type: Outer Shroud Contact; Number of Positions: 5; Voltage Rating (AC): 50V; Wire/Cable Gauge: 26AWG; Series: GH; Mount: Surface Mount; Housing Material: Nylon; Contact Type: Outer Shroud Contact; REACH SVHC: No SVHC; Number of Rows: 1; Lead Free: Lead Free; Color: Natural; Contact Material: Bronze; Contact Plating: Tin; Max Operating Temperature: 85°C; Orientation: Right Angle; Number of Contacts: 5; Voltage Rating: 50V; Housing Color: Natural; Termination: Solder; Min Operating Temperature: -25°C; Fastening Type: Ramp; Packaging: Tape and Reel
J20 J21 = CMP-17439-000068-1: as J13 on sheet S6_Debug_Safety_Port; Orientation: Right Angle; REACH SVHC: No SVHC; Insulation Color: Natural; Housing Material: Nylon; Mount: Surface Mount; Flammability Rating: UL94 V-0; Color: Natural; Number of Rows: 1; Housing Color: Natural; Termination: Solder; Voltage Rating (AC): 50V; Max Operating Temperature: 85°C; Connector Type: Header; Series: GH; Packaging: Tape and Reel; Contact Finish - Mating: TIN; Lead Free: Lead Free; Fastening Type: Ramp; Contact Plating: Tin; Contact Material: Bronze; Insulation Material: Nylon; Contact Type: Outer Shroud Contact; Number of Contacts: 3; Min Operating Temperature: -25°C; Contact Shape: Rectangular
J22 = CMP-17439-000411-1: as J7 on sheet S7_Ethernet; Termination: Solder; Mount: Surface Mount; REACH SVHC: No SVHC; Packaging: Cut Tape; Contact Material: Bronze; Series: GH; Orientation: Right Angle; Lead Free: Lead Free; Housing Material: Nylon; Contact Plating: Tin; Housing Color: Natural; Number of Rows: 1; Pitch: 1.25mm; Number of Positions: 4
R83 = CMP-2000-07588-1: as R74 on sheet S6_Debug_Safety_Port; RoHSCompliant: True; Lead Free: LeadFree; Package Quantity: 1; Contact Plating: Tin; Length: 1mm; Radiation Hardening: No; REACH SVHC: NoSVHC; Max Operating Temperature: 155degC; Depth: 0.5mm; Case Code (Imperial): 0402; Military Standard: Not; Package Description: 2-Pin Surface Mount Device, Body 1 x 0.5 mm; Termination: SMD/SMT; Case Code (Metric): 1005; Height: 0.35mm; Packaging: TapeandReel; Voltage Rating (DC): 50V; Package Reference: 402; Number of Pins: 2; Tolerance: 1%; Mounting Technology: SurfaceMount; Width: 0.02inch; Mount: SurfaceMount; Datasheet URL: https://industrial.panasonic.com/cdbs/www-data/pdf/RDA0000/AOA0000C304.pdf; Composition: ThickFilm; Datasheet Version: 02/2017; Manufacturer URL: http://www.panasonic.com/; Max Power Dissipation: 100mW; Number of Terminations: 2; Min Operating Temperature: -55degC
R84 = CMP-2002-01131-1: Manufacturer: Panasonic; Part Number: ERJ2RKF2200X
R85 = CMP-2002-03042-1: Manufacturer: Vishay Dale; Part Number: CRCW0402100RFKEDHP
R86 = CMP-1011-00510-4: as R56 on sheet S7_Ethernet; PartNumber: ERJ-2RKF1001X; DatasheetVersion: 04/2015; Radiation Hardening: No; Pins: 2; Height: 0.35 mm; RoHSCompliant: true; Case Code (Imperial): 0402; ComponentLink2Description: Datasheet; ComponentLink1Description: Manufacturer URL; PackageReference: 0402; Mount: Surface Mount; Package Quantity: 10000; Tolerance: 1%; ComponentLink1URL: http://www.panasonic.com/; PackageDescription: 2-Pin Surface Mount Device, Body 1 x 0.5 mm; Mounting Technology: Surface Mount; Case Code (Metric): 1005; ComponentLink2URL: http://industrial.panasonic.com/cdbs/www-data/pdf/RDA0000/AOA0000C86.pdf; REACH SVHC: Yes; Packaging: Tape and Reel; Max Operating Temperature: 155 degC; Min Operating Temperature: -55 degC; Width: 0.5 mm; Length: 1 mm

## Nets that join several sheets
ETH_VDD_3V3: S3_PowSwitch (C24.2 IC6.8), S7_Ethernet (10 pins)
GND: S1_Connectors (31 pins), S2_Power (34 pins), S3_PowSwitch (22 pins), S4_Pwm_Ports (J23.8 J24.8), S5_Gps_Telem_Ports (24 pins), S6_Debug_Safety_Port (15 pins), S7_Ethernet (22 pins), S6_Can_SPI_Uart_Ports (32 pins), S7_CRSF_IBUS_SBUS_DSM_Ports (24 pins)
VDD_3V3_OUT: S3_PowSwitch (C25.2 C26.1 IC6.7), S6_Debug_Safety_Port (C52.2 C53.1), S7_CRSF_IBUS_SBUS_DSM_Ports (C64.1 C65.1)
VDD_5V_HIPOWER: S3_PowSwitch (C13.1 C14.1 IC3.8), S5_Gps_Telem_Ports (8 pins)
VDD_5V_IN: S1_Connectors (J1.47 J1.49 J1.51 J1.53), S2_Power (11 pins), S3_PowSwitch (7 pins)
VDD_5V_PERIPH: S3_PowSwitch (C16.1 C17.1 IC4.8), S6_Debug_Safety_Port (C50.2 C51.1 LS0.1), S6_Can_SPI_Uart_Ports (10 pins), S7_CRSF_IBUS_SBUS_DSM_Ports (8 pins)
ADC1_3V3: S1_Connectors (J1.88), S7_CRSF_IBUS_SBUS_DSM_Ports (R86.2)
ADC1_6V6: S1_Connectors (J1.86), S7_CRSF_IBUS_SBUS_DSM_Ports (D41.2 J22.3)
BUZZER_1: S1_Connectors (J2.20), S6_Debug_Safety_Port (Q4.1 R74.2)
CAN1_H: S1_Connectors (J1.79), S2_Power (D2.2 J3.3), S6_Can_SPI_Uart_Ports (D23.2 J14.2)
CAN1_L: S1_Connectors (J1.81), S2_Power (D1.2 J3.4), S6_Can_SPI_Uart_Ports (D24.2 J14.3)
CAN2_H: S1_Connectors (J1.73), S2_Power (D4.2 J4.3), S6_Can_SPI_Uart_Ports (D26.2 J15.2)
CAN2_L: S1_Connectors (J1.75), S2_Power (D3.2 J4.4), S6_Can_SPI_Uart_Ports (D27.2 J15.3)
ETH_CRS_DV: S1_Connectors (J2.7), S7_Ethernet (R52.1)
ETH_MDC: S1_Connectors (J2.33), S7_Ethernet (IC7.25)
ETH_MDIO: S1_Connectors (J2.31), S7_Ethernet (IC7.24 R50.1)
ETH_POWER_EN: S1_Connectors (J2.18), S7_Ethernet (X1.1)
ETH_REF_CLK: S1_Connectors (J2.3), S7_Ethernet (IC7.28 R62.2)
ETH_RXD0: S1_Connectors (J2.11), S7_Ethernet (R53.1)
ETH_RXD1: S1_Connectors (J2.15), S7_Ethernet (R54.1)
ETH_TX_EN: S1_Connectors (J2.27), S7_Ethernet (IC7.3)
ETH_TXD0: S1_Connectors (J2.19), S7_Ethernet (IC7.4)
ETH_TXD1: S1_Connectors (J2.23), S7_Ethernet (IC7.5)
FMU_CAP1: S1_Connectors (J1.17), S4_Pwm_Ports (R9.1)
FMU_CAP2: S1_Connectors (J1.15), S4_Pwm_Ports (R10.1)
FMU_CAP3: S1_Connectors (J1.13), S4_Pwm_Ports (R11.1)
FMU_CAP4: S1_Connectors (J1.11), S4_Pwm_Ports (R12.1)
FMU_CAP5: S1_Connectors (J1.7), S4_Pwm_Ports (R13.1)
FMU_CAP6: S1_Connectors (J1.5), S4_Pwm_Ports (R14.1)
FMU_CAP7: S1_Connectors (J1.3), S4_Pwm_Ports (R15.1)
FMU_CAP8: S1_Connectors (J1.1), S4_Pwm_Ports (R16.1)
FMU_CH1: S1_Connectors (J1.37), S4_Pwm_Ports (R1.1)
FMU_CH2: S1_Connectors (J1.35), S4_Pwm_Ports (R2.1)
FMU_CH3: S1_Connectors (J1.33), S4_Pwm_Ports (R3.1)
FMU_CH4: S1_Connectors (J1.31), S4_Pwm_Ports (R4.1)
FMU_CH5: S1_Connectors (J1.27), S4_Pwm_Ports (R5.1)
FMU_CH6: S1_Connectors (J1.25), S4_Pwm_Ports (R6.1)
FMU_CH7: S1_Connectors (J1.23), S4_Pwm_Ports (R7.1)
FMU_CH8: S1_Connectors (J1.21), S4_Pwm_Ports (R8.1)
I2C1_SCL_GPS1: S1_Connectors (J2.16), S5_Gps_Telem_Ports (R44.1)
I2C1_SDA_GPS1: S1_Connectors (J2.14), S5_Gps_Telem_Ports (R45.1)
I2C2_SCL_GPS2: S1_Connectors (J2.12), S5_Gps_Telem_Ports (R48.1)
I2C2_SDA_GPS2: S1_Connectors (J2.10), S5_Gps_Telem_Ports (R49.1)
I2C3_SCL_EXT1: S1_Connectors (J2.8), S6_Can_SPI_Uart_Ports (R81.1)
I2C3_SDA_EXT1: S1_Connectors (J2.6), S6_Can_SPI_Uart_Ports (R82.1)
I2C4_SCL_EXT2: S1_Connectors (J2.4), S6_Can_SPI_Uart_Ports (R77.1)
I2C4_SDA_EXT2: S1_Connectors (J2.2), S6_Can_SPI_Uart_Ports (R78.1)
nPOWER_IN_A: S1_Connectors (J1.55), S2_Power (IC1.7 R31.2)
nPOWER_IN_B: S1_Connectors (J1.57), S2_Power (IC1.8 R32.2)
nPOWER_IN_C: S1_Connectors (J1.59), S2_Power (IC1.9 R33.2)
nVDD_5V_HIPOWER_EN: S1_Connectors (J1.90), S3_PowSwitch (R36.2)
nVDD_5V_HIPOWER_OC: S1_Connectors (J1.92), S3_PowSwitch (R35.2)
nVDD_5V_PERIPH_EN: S1_Connectors (J1.94), S3_PowSwitch (R39.2)
nVDD_5V_PERIPH_OC: S1_Connectors (J1.96), S3_PowSwitch (R38.2)
PPM_INPUT: S1_Connectors (J1.52), S7_CRSF_IBUS_SBUS_DSM_Ports (R84.1)
RSSI_IN: S1_Connectors (J1.46), S7_CRSF_IBUS_SBUS_DSM_Ports (R83.1 R85.1)
SAFETY_SWITCH_IN: S1_Connectors (J2.24), S6_Debug_Safety_Port (R72.1)
SAFETY_SWITCH_OUT_LED: S1_Connectors (J2.22), S6_Debug_Safety_Port (R71.1)
SPI5_MISO: S1_Connectors (J2.39), S6_Can_SPI_Uart_Ports (E6.7)
SPI5_MOSI: S1_Connectors (J2.41), S6_Can_SPI_Uart_Ports (E6.9)
SPI5_nCS1: S1_Connectors (J2.43), S6_Can_SPI_Uart_Ports (E6.10)
SPI5_nCS2: S1_Connectors (J2.45), S6_Can_SPI_Uart_Ports (D29.2 J16.6)
SPI5_RESET: S1_Connectors (J2.47), S6_Can_SPI_Uart_Ports (D30.2 J16.7)
SPI5_SCK: S1_Connectors (J2.37), S6_Can_SPI_Uart_Ports (E6.6)
SWCLK: S1_Connectors (J1.91), S6_Debug_Safety_Port (E5.10)
SWDIO: S1_Connectors (J1.89), S6_Debug_Safety_Port (E5.9)
UART4_RX_EXT: S1_Connectors (J1.56), S6_Can_SPI_Uart_Ports (R80.1)
UART4_TX_EXT: S1_Connectors (J1.58), S6_Can_SPI_Uart_Ports (R79.1)
UART5_RX_EXT: S1_Connectors (J1.40), S6_Can_SPI_Uart_Ports (R76.1)
UART5_TX_EXT: S1_Connectors (J1.42), S6_Can_SPI_Uart_Ports (R75.1)
UART7_CTS_TELEM2: S1_Connectors (J1.6), S5_Gps_Telem_Ports (R69.1)
UART7_RTS_TELEM2: S1_Connectors (J1.4), S5_Gps_Telem_Ports (R70.1)
UART7_RX_TELEM2: S1_Connectors (J1.10), S5_Gps_Telem_Ports (R68.1)
UART7_TX_TELEM2: S1_Connectors (J1.12), S5_Gps_Telem_Ports (R67.1)
UART8_RX_GPS2: S1_Connectors (J1.16), S5_Gps_Telem_Ports (R47.1)
UART8_TX_GPS2: S1_Connectors (J1.18), S5_Gps_Telem_Ports (R46.1)
USART1_RX_GPS1: S1_Connectors (J1.34), S5_Gps_Telem_Ports (R43.1)
USART1_TX_GPS1: S1_Connectors (J1.36), S5_Gps_Telem_Ports (R42.1)
USART2_CTS_TELEM1: S1_Connectors (J1.24), S5_Gps_Telem_Ports (R65.1)
USART2_RTS_TELEM1: S1_Connectors (J1.22), S5_Gps_Telem_Ports (R66.1)
USART2_RX_TELEM1: S1_Connectors (J1.28), S5_Gps_Telem_Ports (R64.1)
USART2_TX_TELEM1: S1_Connectors (J1.30), S5_Gps_Telem_Ports (R63.1)
USART3_RX_DEBUG: S1_Connectors (J1.85), S6_Debug_Safety_Port (D17.2)
USART3_TX_DEBUG: S1_Connectors (J1.87), S6_Debug_Safety_Port (E5.6)
USART6_RX_SBUS_DSM: S1_Connectors (J1.48), S7_CRSF_IBUS_SBUS_DSM_Ports (D35.2 J19.2)
USB_DM: S1_Connectors (J1.64), S2_Power (IC2.4)
USB_DP: S1_Connectors (J1.62), S2_Power (IC2.6)